# Altium project Flight Controller SoM.PrjPcb (part 2 of 2)

## Sheet MCU_IO.SchDoc: MCU - Peripheral and Pin Assignment
size A2; ApprovedBy: Weymen Koo; CheckedBy: -; DrawnBy: Weymen Koo; DocumentNumber: UBCAD-FCSOM-SCH; Revision: A; SheetNumber: 3; SheetTotal: 18; ProjectTitle: Flight Controller SoM; Status: PRELIMINARY; ReleaseDate: 2026-11-14
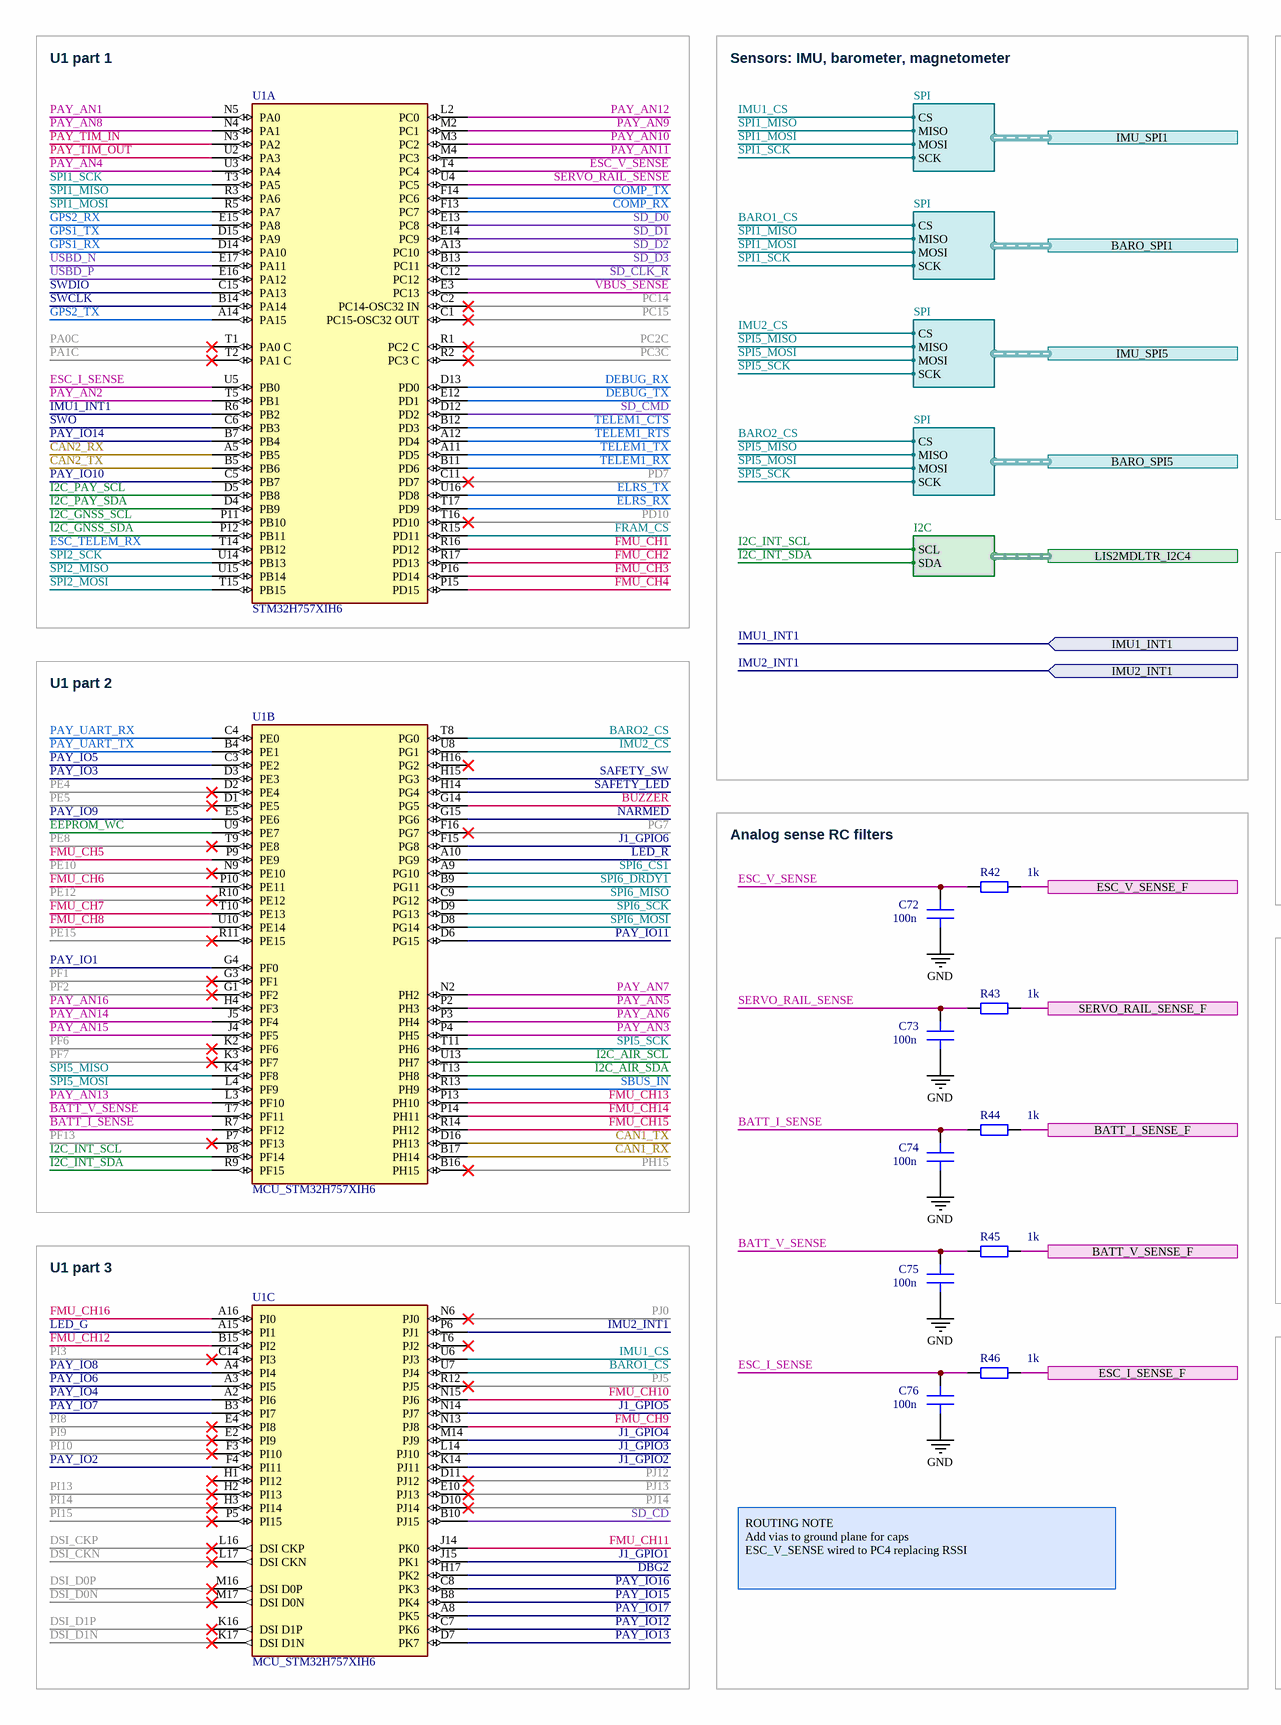
[diagram p12: MCU_IO.SchDoc, left]
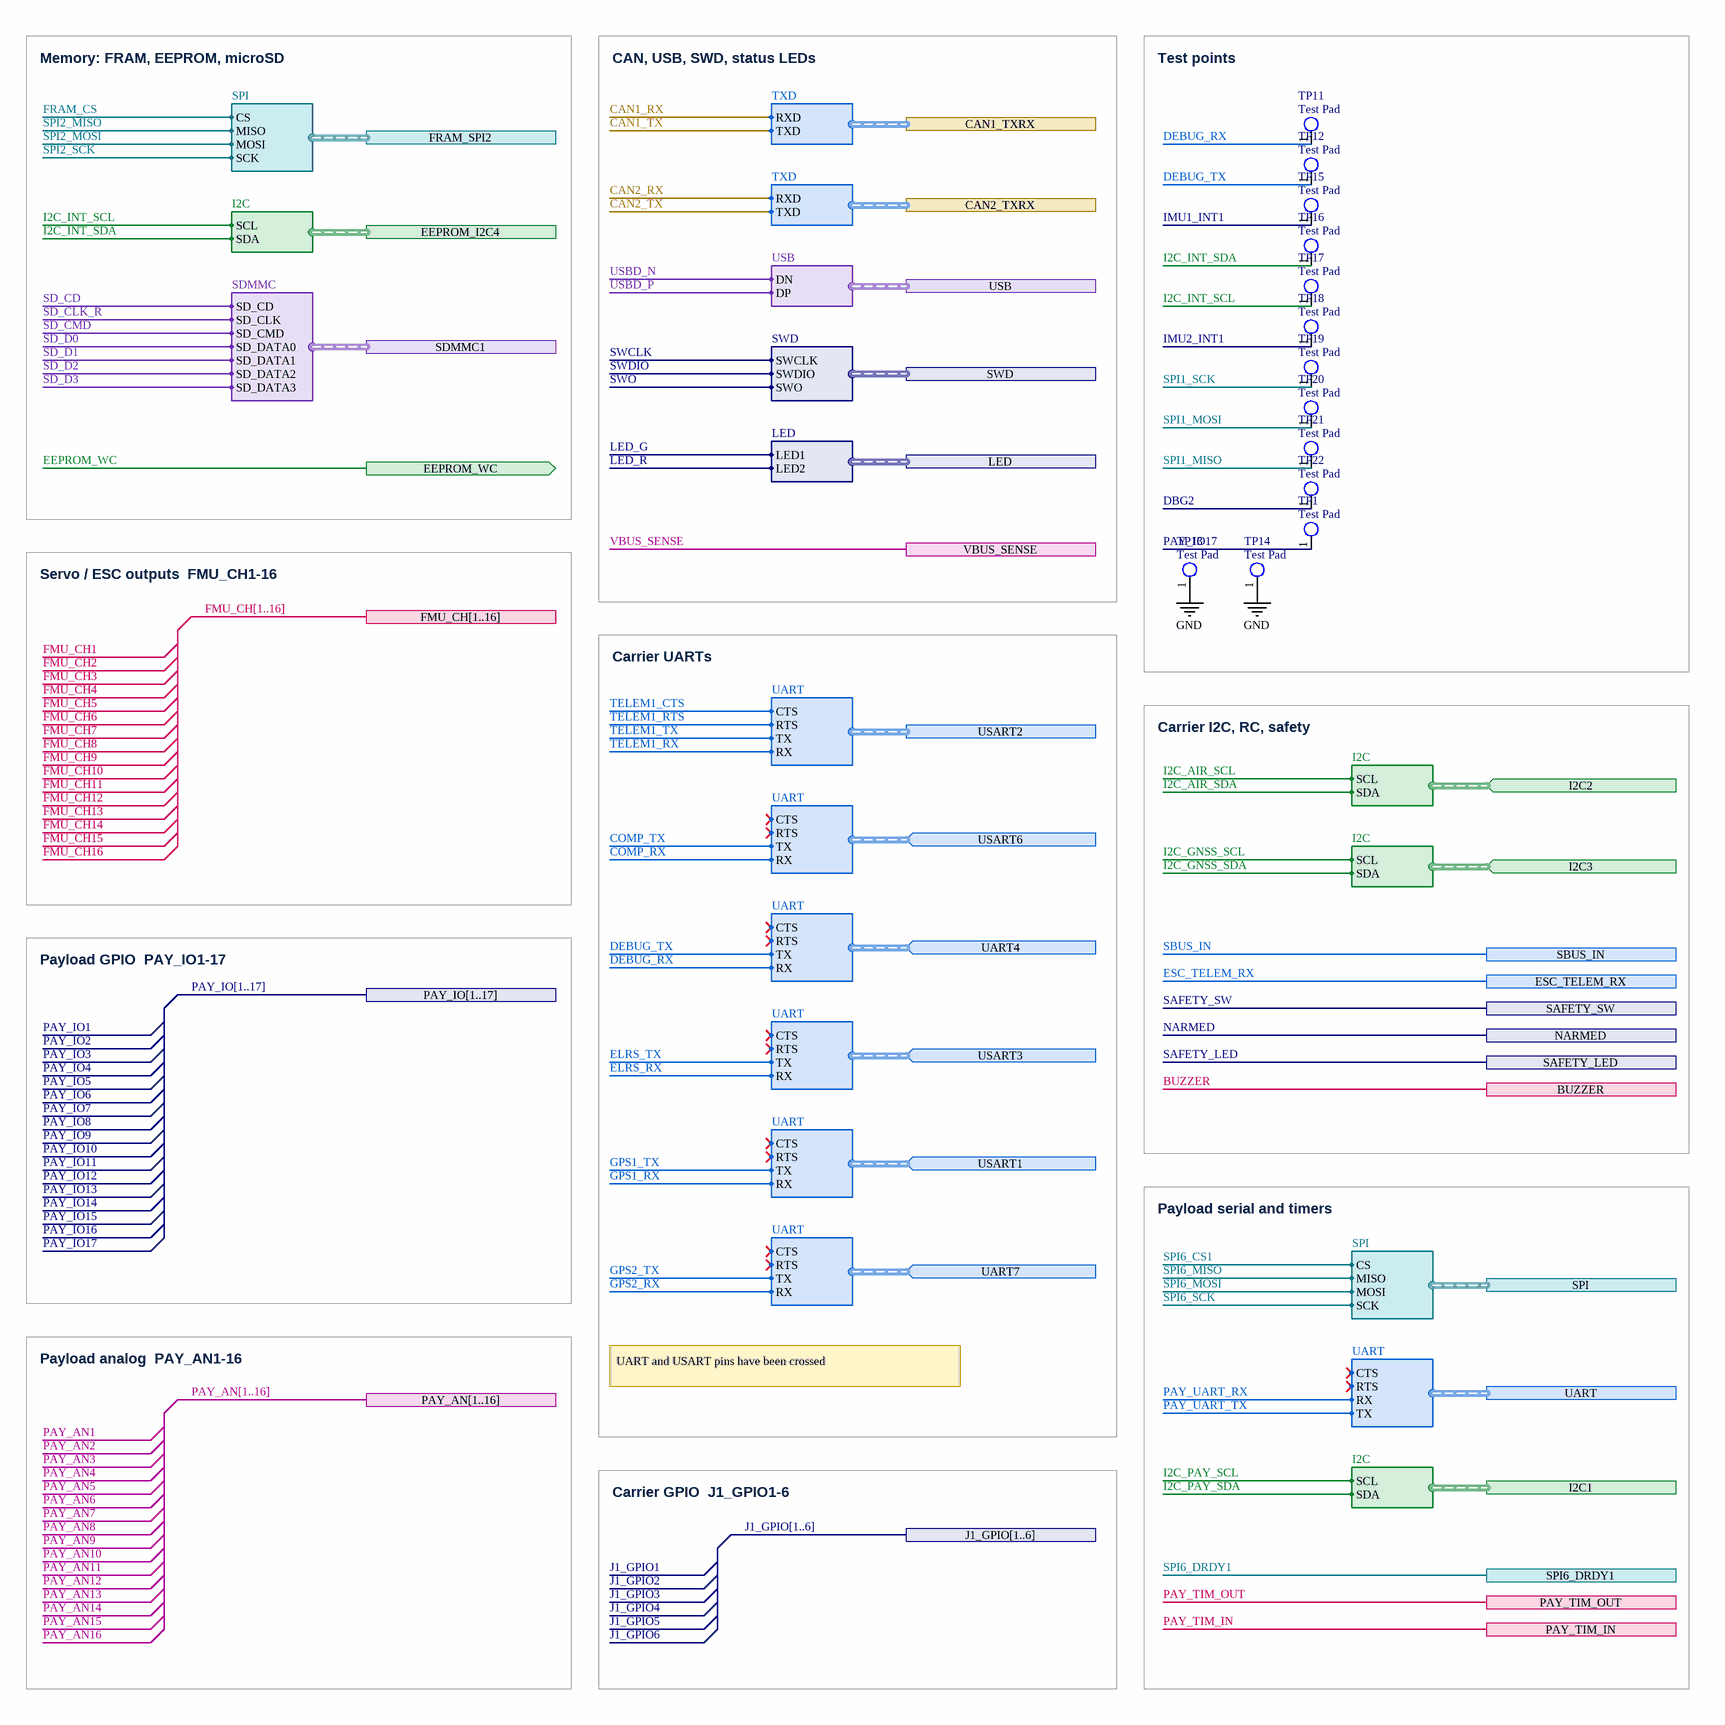
[diagram p13: MCU_IO.SchDoc, right]

### Parts
C72  100n  [IPC C C0402 NO SILK]
C73  100n  [IPC C C0402 NO SILK]
C74  100n  [IPC C C0402 NO SILK]
C75  100n  [IPC C C0402 NO SILK]
C76  100n  [IPC C C0402 NO SILK]
R42  1k  [IPC C R0402 NO SILK]
R43  1k  [IPC C R0402 NO SILK]
R44  1k  [IPC C R0402 NO SILK]
R45  1k  [IPC C R0402 NO SILK]
R46  1k  [IPC C R0402 NO SILK]
TP1  Test Pad  [PCBComponent_1]
TP11  Test Pad  [PCBComponent_1]
TP12  Test Pad  [PCBComponent_1]
TP13  Test Pad  [PCBComponent_1]
TP14  Test Pad  [PCBComponent_1]
TP15  Test Pad  [PCBComponent_1]
TP16  Test Pad  [PCBComponent_1]
TP17  Test Pad  [PCBComponent_1]
TP18  Test Pad  [PCBComponent_1]
TP19  Test Pad  [PCBComponent_1]
TP20  Test Pad  [PCBComponent_1]
TP21  Test Pad  [PCBComponent_1]
TP22  Test Pad  [PCBComponent_1]
U1  STM32H757XIH6  [FP-TFBGA2650-A07U-MFG]  (parts A,B,C of 5)

### Blocks framed on the sheet
U1 part 1: U1
Test points: TP1 TP11-TP22
U1 part 2: U1
Analog sense RC filters: C72-C76 R42-R46
U1 part 3: U1

### Ports
BARO_SPI1 (harness SPI, see 1[5B], 5[6B]), BARO_SPI5 (harness SPI, see 1[5B], 8[6B]), BATT_I_SENSE_F (see 1[4C], 18[2C]), BATT_V_SENSE_F (see 1[4C], 18[2C]), BUZZER (see 1[4D], 18[5A]), CAN1_TXRX (harness TXD, see 1[4C], 13[2B]), CAN2_TXRX (harness TXD, see 1[5A], 14[2B]), EEPROM_I2C4 (harness I2C, see 1[4B], 12[7B]), EEPROM_WC (out, see 1[4B], 12[2B]), ESC_I_SENSE_F (see 1[4C], 18[2C]), ESC_TELEM_RX (see 1[4D], 18[2D]), ESC_V_SENSE_F (see 1[4C], 18[2C]), FMU_CH[1..16] (see 1[4C], 18[5B]), FRAM_SPI2 (harness SPI, see 1[4B], 10[6C]), I2C1 (harness I2C, see 1[5C], 17[5C]), I2C2 (in, harness I2C, see 1[4C], 18[5D]), I2C3 (in, harness I2C, see 1[4C], 18[5C]), IMU1_INT1 (in, see 1[5A], 6[6B]), IMU2_INT1 (in, see 1[5B], 9[7C]), IMU_SPI1 (harness SPI, see 1[5A], 6[7B]), IMU_SPI5 (harness SPI, see 1[5B], 9[7B]), J1_GPIO[1..6] (see 1[4C], 18[5C]), LED (harness LED, see 1[5D], 15[5B]), LIS2MDLTR_I2C4 (harness I2C, see 1[5B], 7[6B]), NARMED (see 1[4D], 18[5A]), PAY_AN[1..16] (see 1[5C], 17[2C]), PAY_IO[1..17] (see 1[5C], 17[5A]), PAY_TIM_IN (see 1[5C], 17[5C]), PAY_TIM_OUT (see 1[5C], 17[5C]), SAFETY_LED (see 1[4D], 18[5A]), SAFETY_SW (see 1[4D], 18[5A]), SBUS_IN (see 1[4D], 18[2D]), SDMMC1 (harness SDMMC, see 1[4B], 11[7B]), SERVO_RAIL_SENSE_F (see 1[4D], 18[2C]), SPI6_DRDY1 (see 1[5C], 17[7C]), SPI (harness SPI, see 1[5C], 17[7B]), SWD (harness SWD, see 1[4A], 16[6C]), UART4 (in, harness UART, see 1[4C], 18[7B]), UART7 (in, harness UART, see 1[4C], 18[7B]), UART (harness UART, see 1[5C], 17[7A]), USART1 (in, harness UART, see 1[4C], 18[7B]), USART2 (harness UART, see 1[4C], 18[7C]), USART3 (in, harness UART, see 1[4C], 18[7A]), USART6 (in, harness UART, see 1[4C], 18[7A]), USB (harness USB, see 1[4A], 16[6B]), VBUS_SENSE (see 1[4B], 16[6A])

### Harnesses
TXD: RXD, TXD
SPI: CS, MISO, MOSI, SCK
SWD: SWCLK, SWDIO, SWO
USB: DN, DP
LED: LED1, LED2
SDMMC: SD_CD, SD_CLK, SD_CMD, SD_DATA0, SD_DATA1, SD_DATA2, SD_DATA3
I2C: SCL, SDA
UART: CTS, RTS, RX, TX
UART: CTS, RTS, TX, RX

### Nets
GND: C72.2 C73.2 C74.2 C75.2 C76.2 TP13.1 TP14.1
BARO1_CS: U1.U7(PJ4) ; port BARO_SPI1.CS
BARO2_CS: U1.T8(PG0) ; port BARO_SPI5.CS
BATT_I_SENSE: C74.1 R44.1 U1.R7(PF12)
BATT_I_SENSE_F: R44.2 ; port BATT_I_SENSE_F
BATT_V_SENSE: C75.1 R45.1 U1.T7(PF11)
BATT_V_SENSE_F: R45.2 ; port BATT_V_SENSE_F
BUZZER: U1.G14(PG5) ; port BUZZER
CAN1_RX: U1.B17(PH14) ; port CAN1_TXRX.RXD
CAN1_TX: U1.D16(PH13) ; port CAN1_TXRX.TXD
CAN2_RX: U1.A5(PB5) ; port CAN2_TXRX.RXD
CAN2_TX: U1.B5(PB6) ; port CAN2_TXRX.TXD
COMP_RX: U1.F13(PC7) ; port USART6.RX
COMP_TX: U1.F14(PC6) ; port USART6.TX
DBG2: TP22.1 U1.H17(PK2)
DEBUG_RX: TP11.1 U1.D13(PD0) ; port UART4.RX
DEBUG_TX: TP12.1 U1.E12(PD1) ; port UART4.TX
DSI_CKN: U1.L17(DSI_CKN)
DSI_CKP: U1.L16(DSI_CKP)
DSI_D0N: U1.M17(DSI_D0N)
DSI_D0P: U1.M16(DSI_D0P)
DSI_D1N: U1.K17(DSI_D1N)
DSI_D1P: U1.K16(DSI_D1P)
EEPROM_WC: U1.U9(PE7) ; port EEPROM_WC
ELRS_RX: U1.T17(PD9) ; port USART3.RX
ELRS_TX: U1.U16(PD8) ; port USART3.TX
ESC_I_SENSE: C76.1 R46.1 U1.U5(PB0)
ESC_I_SENSE_F: R46.2 ; port ESC_I_SENSE_F
ESC_TELEM_RX: U1.T14(PB12) ; port ESC_TELEM_RX
ESC_V_SENSE: C72.1 R42.1 U1.T4(PC4)
ESC_V_SENSE_F: R42.2 ; port ESC_V_SENSE_F
FMU_CH1: U1.R16(PD12)
FMU_CH2: U1.R17(PD13)
FMU_CH3: U1.P16(PD14)
FMU_CH4: U1.P15(PD15)
FMU_CH5: U1.P9(PE9)
FMU_CH6: U1.P10(PE11)
FMU_CH7: U1.T10(PE13)
FMU_CH8: U1.U10(PE14)
FMU_CH9: U1.N13(PJ8)
FMU_CH10: U1.N15(PJ6)
FMU_CH11: U1.J14(PK0)
FMU_CH12: U1.B15(PI2)
FMU_CH13: U1.P13(PH10)
FMU_CH14: U1.P14(PH11)
FMU_CH15: U1.R14(PH12)
FMU_CH16: U1.A16(PI0)
FRAM_CS: U1.R15(PD11) ; port FRAM_SPI2.CS
GPS1_RX: U1.D14(PA10) ; port USART1.RX
GPS1_TX: U1.D15(PA9) ; port USART1.TX
GPS2_RX: U1.E15(PA8) ; port UART7.RX
GPS2_TX: U1.A14(PA15) ; port UART7.TX
I2C_AIR_SCL: U1.U13(PH7) ; port I2C2.SCL
I2C_AIR_SDA: U1.T13(PH8) ; port I2C2.SDA
I2C_GNSS_SCL: U1.P11(PB10) ; port I2C3.SCL
I2C_GNSS_SDA: U1.P12(PB11) ; port I2C3.SDA
I2C_INT_SCL: TP17.1 U1.P8(PF14) ; port EEPROM_I2C4.SCL, port LIS2MDLTR_I2C4.SCL
I2C_INT_SDA: TP16.1 U1.R9(PF15) ; port EEPROM_I2C4.SDA, port LIS2MDLTR_I2C4.SDA
I2C_PAY_SCL: U1.D5(PB8) ; port I2C1.SCL
I2C_PAY_SDA: U1.D4(PB9) ; port I2C1.SDA
IMU1_CS: U1.U6(PJ3) ; port IMU_SPI1.CS
IMU1_INT1: TP15.1 U1.R6(PB2) ; port IMU1_INT1
IMU2_CS: U1.U8(PG1) ; port IMU_SPI5.CS
IMU2_INT1: TP18.1 U1.P6(PJ1) ; port IMU2_INT1
J1_GPIO1: U1.J15(PK1)
J1_GPIO2: U1.K14(PJ11)
J1_GPIO3: U1.L14(PJ10)
J1_GPIO4: U1.M14(PJ9)
J1_GPIO5: U1.N14(PJ7)
J1_GPIO6: U1.F15(PG8)
LED_G: U1.A15(PI1) ; port LED.LED1
LED_R: U1.A10(PG9) ; port LED.LED2
NARMED: U1.G15(PG6) ; port NARMED
PA0C: U1.T1(PA0_C)
PA1C: U1.T2(PA1_C)
PAY_AN1: U1.N5(PA0)
PAY_AN2: U1.T5(PB1)
PAY_AN3: U1.P4(PH5)
PAY_AN4: U1.U3(PA4)
PAY_AN5: U1.P2(PH3)
PAY_AN6: U1.P3(PH4)
PAY_AN7: U1.N2(PH2)
PAY_AN8: U1.N4(PA1)
PAY_AN9: U1.M2(PC1)
PAY_AN10: U1.M3(PC2)
PAY_AN11: U1.M4(PC3)
PAY_AN12: U1.L2(PC0)
PAY_AN13: U1.L3(PF10)
PAY_AN14: U1.J5(PF4)
PAY_AN15: U1.J4(PF5)
PAY_AN16: U1.H4(PF3)
PAY_IO1: U1.G4(PF0)
PAY_IO2: U1.F4(PI11)
PAY_IO3: U1.D3(PE3)
PAY_IO4: U1.A2(PI6)
PAY_IO5: U1.C3(PE2)
PAY_IO6: U1.A3(PI5)
PAY_IO7: U1.B3(PI7)
PAY_IO8: U1.A4(PI4)
PAY_IO9: U1.E5(PE6)
PAY_IO10: U1.C5(PB7)
PAY_IO11: U1.D6(PG15)
PAY_IO12: U1.C7(PK6)
PAY_IO13: U1.D7(PK7)
PAY_IO14: U1.B7(PB4)
PAY_IO15: U1.B8(PK4)
PAY_IO16: U1.C8(PK3)
PAY_IO17: TP1.1 U1.A8(PK5)
PAY_TIM_IN: U1.N3(PA2) ; port PAY_TIM_IN
PAY_TIM_OUT: U1.U2(PA3) ; port PAY_TIM_OUT
PAY_UART_RX: U1.C4(PE0) ; port UART.RX
PAY_UART_TX: U1.B4(PE1) ; port UART.TX
PC2C: U1.R1(PC2_C)
PC3C: U1.R2(PC3_C)
PC14: U1.C2(PC14-OSC32_IN)
PC15: U1.C1(PC15-OSC32_OUT)
PD7: U1.C11(PD7)
PD10: U1.T16(PD10)
PE4: U1.D2(PE4)
PE5: U1.D1(PE5)
PE8: U1.T9(PE8)
PE10: U1.N9(PE10)
PE12: U1.R10(PE12)
PE15: U1.R11(PE15)
PF1: U1.G3(PF1)
PF2: U1.G1(PF2)
PF6: U1.K2(PF6)
PF7: U1.K3(PF7)
PF13: U1.P7(PF13)
PG7: U1.F16(PG7)
PH15: U1.B16(PH15)
PI3: U1.C14(PI3)
PI8: U1.E4(PI8)
PI9: U1.E2(PI9)
PI10: U1.F3(PI10)
PI13: U1.H2(PI13)
PI14: U1.H3(PI14)
PI15: U1.P5(PI15)
PJ0: U1.N6(PJ0)
PJ5: U1.R12(PJ5)
PJ12: U1.D11(PJ12)
PJ13: U1.E10(PJ13)
PJ14: U1.D10(PJ14)
SAFETY_LED: U1.H14(PG4) ; port SAFETY_LED
SAFETY_SW: U1.H15(PG3) ; port SAFETY_SW
SBUS_IN: U1.R13(PH9) ; port SBUS_IN
SD_CD: U1.B10(PJ15) ; port SDMMC1.SD_CD
SD_CLK_R: U1.C12(PC12) ; port SDMMC1.SD_CLK
SD_CMD: U1.D12(PD2) ; port SDMMC1.SD_CMD
SD_D0: U1.E13(PC8) ; port SDMMC1.SD_DATA0
SD_D1: U1.E14(PC9) ; port SDMMC1.SD_DATA1
SD_D2: U1.A13(PC10) ; port SDMMC1.SD_DATA2
SD_D3: U1.B13(PC11) ; port SDMMC1.SD_DATA3
SERVO_RAIL_SENSE: C73.1 R43.1 U1.U4(PC5)
SERVO_RAIL_SENSE_F: R43.2 ; port SERVO_RAIL_SENSE_F
SPI1_MISO: TP21.1 U1.R3(PA6) ; port IMU_SPI1.MISO, port BARO_SPI1.MISO
SPI1_MOSI: TP20.1 U1.R5(PA7) ; port IMU_SPI1.MOSI, port BARO_SPI1.MOSI
SPI1_SCK: TP19.1 U1.T3(PA5) ; port IMU_SPI1.SCK, port BARO_SPI1.SCK
SPI2_MISO: U1.U15(PB14) ; port FRAM_SPI2.MISO
SPI2_MOSI: U1.T15(PB15) ; port FRAM_SPI2.MOSI
SPI2_SCK: U1.U14(PB13) ; port FRAM_SPI2.SCK
SPI5_MISO: U1.K4(PF8) ; port IMU_SPI5.MISO, port BARO_SPI5.MISO
SPI5_MOSI: U1.L4(PF9) ; port IMU_SPI5.MOSI, port BARO_SPI5.MOSI
SPI5_SCK: U1.T11(PH6) ; port IMU_SPI5.SCK, port BARO_SPI5.SCK
SPI6_CS1: U1.A9(PG10) ; port SPI.CS
SPI6_DRDY1: U1.B9(PG11) ; port SPI6_DRDY1
SPI6_MISO: U1.C9(PG12) ; port SPI.MISO
SPI6_MOSI: U1.D8(PG14) ; port SPI.MOSI
SPI6_SCK: U1.D9(PG13) ; port SPI.SCK
SWCLK: U1.B14(PA14) ; port SWD.SWCLK
SWDIO: U1.C15(PA13) ; port SWD.SWDIO
SWO: U1.C6(PB3) ; port SWD.SWO
TELEM1_CTS: U1.B12(PD3) ; port USART2.CTS
TELEM1_RTS: U1.A12(PD4) ; port USART2.RTS
TELEM1_RX: U1.B11(PD6) ; port USART2.RX
TELEM1_TX: U1.A11(PD5) ; port USART2.TX
USBD_N: U1.E17(PA11) ; port USB.DN
USBD_P: U1.E16(PA12) ; port USB.DP
VBUS_SENSE: U1.E3(PC13) ; port VBUS_SENSE

Not connected (* = marked no-connect by the designer): U1 H1(PI12)* H16(PG2)* T6(PJ2)*

### Buses and harness runs
bus FMU_CH[1..16] = port FMU_CH[1..16]
bus J1_GPIO[1..6] = port J1_GPIO[1..6]
bus PAY_AN[1..16] = port PAY_AN[1..16]
bus PAY_IO[1..17] = port PAY_IO[1..17]

### Notes on the sheet
- Sensors: IMU, barometer, magnetometer
- Memory: FRAM, EEPROM, microSD
- CAN, USB, SWD, status LEDs
- Servo / ESC outputs  FMU_CH1-16
- Carrier UARTs
- Carrier I2C, RC, safety
- Payload GPIO  PAY_IO1-17
- Payload serial and timers
- Payload analog  PAY_AN1-16
- UART and USART pins have been crossed
- Carrier GPIO  J1_GPIO1-6
- ROUTING NOTE
  Add vias to ground plane for caps
  ESC_V_SENSE wired to PC4 replacing RSSI
- PROJECT
- KEY
- POWER
- 5 V class
- 3.3 V class
- Core / SMPS
- GND
- SHEET TITLE
- SIGNALS
- NOTES
- SPI
- Analog
- Design
- I2C
- PWM/Timer
- Layout
- UART/RC
- GPIO/Ctrl
- Assembly
- CAN
- Unused pin
- Firmware
- USB/SD/Clk
- Critical
- DRAWN
- DOCUMENT NO.
- CHECKED
- REV
- STATUS
- APPROVED
- DATE
- FILE
- SIZE
- A2
- SHEET
- of

### Library data of the parts
C72-C76 = CMP-002-000000-4: CAP 100n 16V X7R 10% 0402; Manufacturer: Samsung; Manufacturer Part Number: CL05B104KO5NNNC; Value: 100n; Source: Schlib1.SchLib; Design Item ID: Generic CAP 0402; Package: 0402; Tolerance: 10%; Voltage: 16V; Dielectric: X7R; LCSC Part #: C1525
R42-R46 = CMP-008-000000-2: RES 1k 1% 1/16W 0402; Manufacturer: UNI-ROYAL; Manufacturer Part Number: 0402WGF1001TCE; Value: 1k; Source: Schlib1.SchLib; Design Item ID: Generic RES 0402; Package: 0402; Tolerance: 1%; Power: 1/16W; LCSC Part #: C11702
TP1 TP11-TP22 = CMP-092-000000-4: Design Item ID: TP; Source: Testpoint.SchLib
U1 = CMP-029-000010-1: MCU 32-bit ARM Cortex M7/M4 RISC 2MB Flash 3.3V 265-Pin TFBGA Tray; Component Type: Standard; Design Item ID: MCU_STM32H757XIH6; Pin Count: 265; Source: CRLS Lib.SchLib

## Sheet Power.SchDoc: Power - eFuse, Power Mux, Buck, Sensor LDO
size A3; ApprovedBy: Weymen Koo; CheckedBy: -; DrawnBy: Weymen Koo; DocumentNumber: UBCAD-FCSOM-SCH; Revision: A; SheetNumber: 2; SheetTotal: 18; ProjectTitle: Flight Controller SoM; Status: PRELIMINARY; ReleaseDate: 2026-11-14
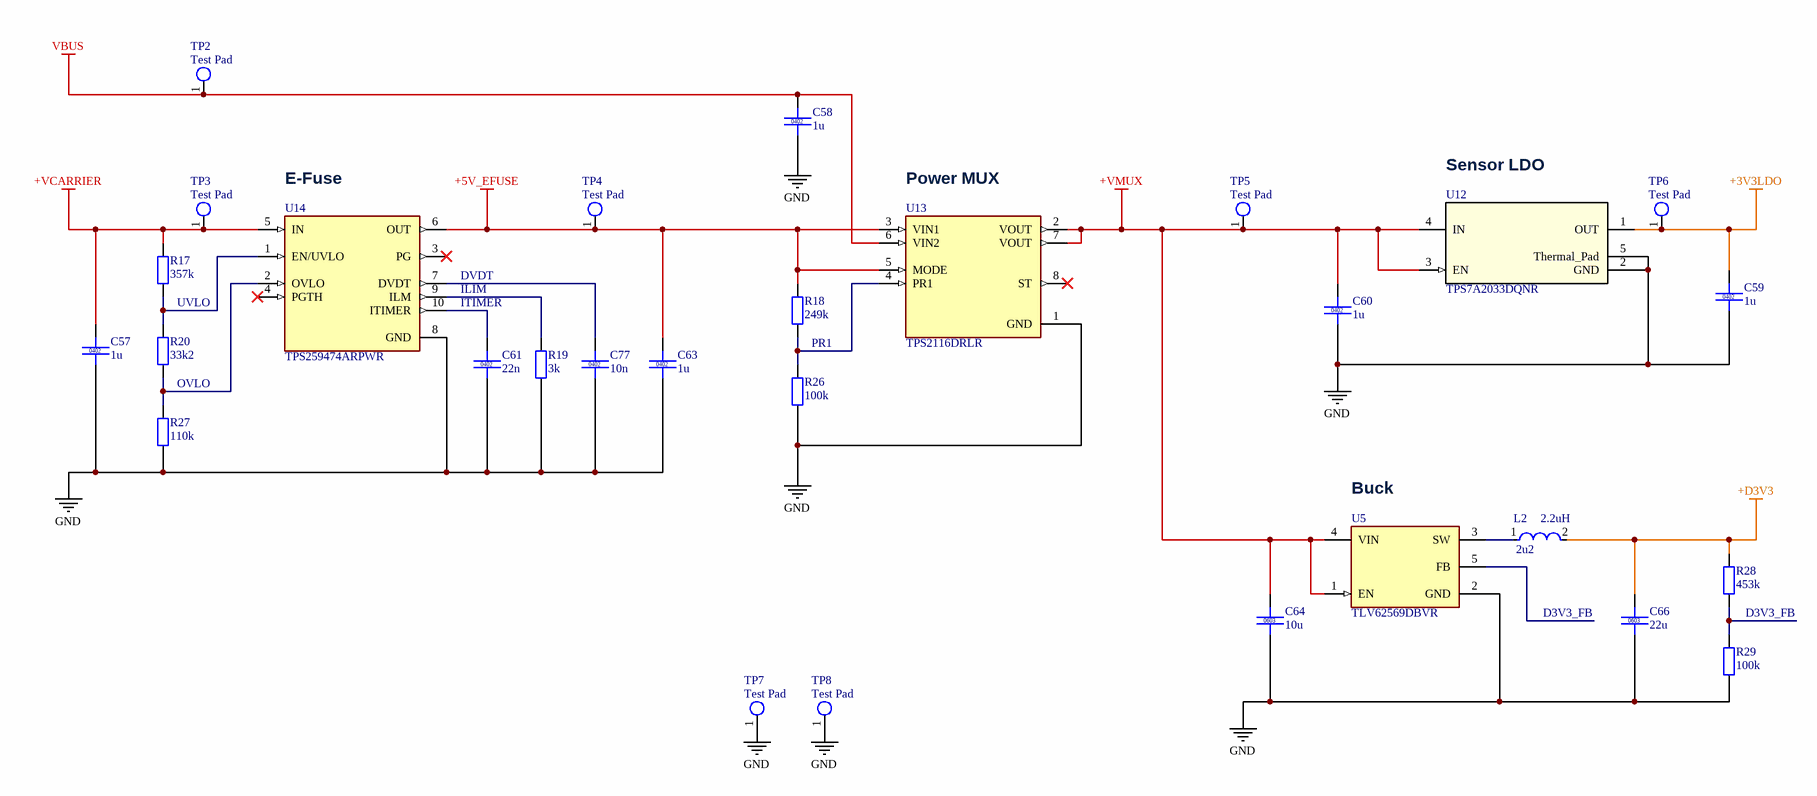
[diagram p14: Power.SchDoc]

### Parts
C57  1u  [CAPC1005X05N]
C58  1u  [CAPC1005X05N]
C59  1u  [CAPC1005X05N]
C60  1u  [CAPC1005X05N]
C61  22n  [CAPC1005X05N]
C63  1u  [CAPC1005X05N]
C64  10u  [CAPC1608X08N]
C66  22u  [CAPC1608X08N]
C77  10n  [CAPC1005X05N]
L2  2u2  Inductance: 2.2uH  [FP-DFE252012C-IPC_B]
R17  357k  [IPC C R0402 NO SILK]
R18  249k  [IPC C R0402 NO SILK]
R19  3k  [IPC C R0402 NO SILK]
R20  33k2  [IPC C R0402 NO SILK]
R26  100k  [IPC C R0402 NO SILK]
R27  110k  [IPC C R0402 NO SILK]
R28  453k  [IPC C R0402 NO SILK]
R29  100k  [IPC C R0402 NO SILK]
TP2  Test Pad  [PCBComponent_1]
TP3  Test Pad  [PCBComponent_1]
TP4  Test Pad  [PCBComponent_1]
TP5  Test Pad  [PCBComponent_1]
TP6  Test Pad  [PCBComponent_1]
TP7  Test Pad  [PCBComponent_1]
TP8  Test Pad  [PCBComponent_1]
U5  TLV62569DBVR  [FP-DBV0005A-MFG]
U12  TPS7A2033DQNR  [DQN0004A-MFG]
U13  TPS2116DRLR  [SOTFL50P160X60-8N]
U14  TPS259474ARPWR  [IC_TPS259474ARPWR]

### Nets
+3V3LDO: C59.1 TP6.1 U12.1(OUT)
+5V_EFUSE: C63.1 R18.2 TP4.1 U13.3(VIN1) U13.5(MODE) U14.6(OUT)
+D3V3: C66.1 L2.2 R28.2
+VCARRIER: C57.1 R17.2 TP3.1 U14.5(IN)
+VMUX: C60.1 C64.1 TP5.1 U5.1(EN) U5.4(VIN) U12.3(EN) U12.4(IN) U13.2(VOUT) U13.7(VOUT)
GND: C57.2 C58.2 C59.2 C60.2 C61.2 C63.2 C64.2 C66.2 C77.2 R19.2 R26.1 R27.1 R29.1 TP7.1 TP8.1 U5.2(GND) U12.2(GND) U12.5(Thermal_Pad) U13.1(GND) U14.8(GND)
VBUS: C58.1 TP2.1 U13.6(VIN2)
D3V3_FB: R28.1 R29.2 U5.5(FB)
DVDT: C77.1 U14.7(DVDT)
ILIM: R19.1 U14.9(ILM)
ITIMER: C61.1 U14.10(ITIMER)
OVLO: R20.1 R27.2 U14.2(OVLO)
PR1: R18.1 R26.2 U13.4(PR1)
UVLO: R17.1 R20.2 U14.1(EN/UVLO)
NetL2_1: L2.1 U5.3(SW)

Not connected (* = marked no-connect by the designer): U13 8(ST)*; U14 3(PG)* 4(PGTH)*

### Notes on the sheet
- (near U14) E-Fuse
- (near U13) Power MUX
- Sensor LDO
- (near U5) Buck
- PROJECT
- KEY
- POWER
- 5 V class
- 3.3 V class
- Core / SMPS
- GND
- SHEET TITLE
- SIGNALS
- NOTES
- SPI
- Analog
- Design
- I2C
- PWM/Timer
- Layout
- UART/RC
- GPIO/Ctrl
- Assembly
- CAN
- Unused pin
- Firmware
- USB/SD/Clk
- Critical
- DRAWN
- DOCUMENT NO.
- CHECKED
- REV
- STATUS
- APPROVED
- DATE
- FILE
- SIZE
- A3
- SHEET
- of

### Library data of the parts
C57-C60 C63 = CMP-002-000094-5: CAP 1u 25V X5R 10% 0402; Manufacturer: Samsung; Manufacturer Part Number: CL05A105KA5NQNC; Value: 1u; Tolerance: 10%; Package: 0402; Voltage: 25V; Dielectric: X5R; LCSC Part #: C52923
C61 = CMP-002-000094-5: CAP 22n 50V X7R 10% 0402; Manufacturer: FH; Manufacturer Part Number: 0402B223K500NT; Value: 22n; Tolerance: 10%; Package: 0402; Voltage: 50V; Dielectric: X7R; LCSC Part #: C1532
C64 = CMP-002-000095-4: CAP 10u 25V X5R 20% 0603; Manufacturer: Samsung; Manufacturer Part Number: CL10A106MA8NRNC; Value: 10u; Tolerance: 20%; Package: 0603; Voltage: 25V; Dielectric: X5R; LCSC Part #: C96446
C66 = CMP-002-000095-4: CAP 22u 6.3V X5R 20% 0603; Manufacturer: Samsung; Manufacturer Part Number: CL10A226MQ8NRNC; Value: 22u; Tolerance: 20%; Package: 0603; Voltage: 6.3V; Dielectric: X5R; LCSC Part #: C59461
C77 = CMP-002-000094-5: CAP 10n 50V X7R 10% 0402; Manufacturer: Samsung; Manufacturer Part Number: CL05B103KB5NNNC; Value: 10n; Tolerance: 10%; Package: 0402; Voltage: 50V; Dielectric: X7R; LCSC Part #: C15195
L2 = CMP-06042-014676-1: Shielded Wirewound Inductor 2.2uH 20% 2300mA 0.082Ω 1008 (2520); Manufacturer: Murata; Manufacturer Part Number: DFE252012F-2R2M=P2; DC Resistance (DCR): 82mR; Test Frequency: 1MHz; Saturation Current: 3.6A; Core Material: Ferrite; Current Rating: 2.3A; Case/Package: 1008; Tolerance: 20%; Max Operating Temperature: 125°C; Shielding: Shielded; Height - Seated (Max): 0.047inch; Packaging: Tape and Reel; Min Operating Temperature: -40°C; Length: 0.098inch; Width: 0.079inch; Case Code (Imperial): 1008; Mount: Surface Mount; Case Code (Metric): 2520; Value: 2u2; Package: 2520
R17 = CMP-008-000000-2: RES 357k 1% 1/16W 0402; Manufacturer: UNI-ROYAL; Manufacturer Part Number: 0402WGF3573TCE; Value: 357k; Source: Schlib1.SchLib; Design Item ID: Generic RES 0402; Package: 0402; Tolerance: 1%; Power: 1/16W; LCSC Part #: C27005
R18 = CMP-008-000000-2: RES 249k 1% 1/16W 0402; Manufacturer: UNI-ROYAL; Manufacturer Part Number: 0402WGF2493TCE; Value: 249k; Source: Schlib1.SchLib; Design Item ID: Generic RES 0402; Package: 0402; Tolerance: 1%; Power: 1/16W
R19 = CMP-008-000000-2: RES 3k 1% 1/16W 0402; Manufacturer: UNI-ROYAL; Manufacturer Part Number: 0402WGF3001TCE; Value: 3k; Source: Schlib1.SchLib; Design Item ID: Generic RES 0402; Package: 0402; Tolerance: 1%; Power: 1/16W; LCSC Part #: C25784
R20 = CMP-008-000000-2: RES 33k2 1% 1/16W 0402; Manufacturer: UNI-ROYAL; Manufacturer Part Number: 0402WGF3322TCE; Value: 33k2; Source: Schlib1.SchLib; Design Item ID: Generic RES 0402; Package: 0402; Tolerance: 1%; Power: 1/16W; LCSC Part #: C122548
R26 R29 = CMP-008-000000-2: RES 100k 1% 1/16W 0402; Manufacturer: UNI-ROYAL; Manufacturer Part Number: 0402WGF1003TCE; Value: 100k; Source: Schlib1.SchLib; Design Item ID: Generic RES 0402; Package: 0402; Tolerance: 1%; Power: 1/16W; LCSC Part #: C25741
R27 = CMP-008-000000-2: RES 110k 1% 1/16W 0402; Manufacturer: UNI-ROYAL; Manufacturer Part Number: 0402WGF1103TCE; Value: 110k; Source: Schlib1.SchLib; Design Item ID: Generic RES 0402; Package: 0402; Tolerance: 1%; Power: 1/16W
R28 = CMP-008-000000-2: RES 453k 1% 1/16W 0402; Manufacturer: Walsin; Manufacturer Part Number: WR04X4533FTL; Value: 453k; Source: Schlib1.SchLib; Design Item ID: Generic RES 0402; Package: 0402; Tolerance: 1%; Power: 1/16W; LCSC Part #: C170322
TP2-TP8 = CMP-092-000000-4: Design Item ID: TP; Source: Testpoint.SchLib
U5 = CMP-04918-000387-1: IC REG BUCK ADJ 2A SOT23-5; Output Configuration: Positive; Min Output Voltage: 600mV; Max Output Voltage: 5.5V; Switching Frequency: 1.5MHz; Output Type: Adjustable; Synchronous Rectifier: Yes; Min Input Voltage: 2.5V; Output Current: 2A; Mount: Surface Mount; Min Operating Temperature: -40°C; Max Operating Temperature: 125°C; RoHS Compliant: Yes; Max Input Voltage: 5.5V; Case/Package: SOT-23-5; Packaging: Cut Tape
U12 = CMP-341-000000-2: 300mA ultra-low-noise low-IQ low-dropout (LDO) linear regulator with high PSRR 4-X2SON -40 to 125; Manufacturer_Name: Texas Instruments; Design Item ID: TPS7A2033DQNR; Source: TPS7A2033DQNR.SchLib; RefDes: RefDes; TYPE: TYPE; Copyright: Copyright (C) 2025 Ultra Librarian. All rights reserved.; Manufacturer_Part_Number: TPS7A2033DQNR
U13 = CMP-110-000001-1: Power mux, 1.6 V to 5.5 V, 2.5 A, priority select; MF: Texas Instruments; Package: None; Value: *; Design Item ID: TPS2116DRLR; Check_prices: https://www.snapeda.com/parts/TPS2116DRLR/Texas+Instruments/view-part/?ref=eda; Source: TPS2116DRLR.SchLib; SnapEDA_Link: https://www.snapeda.com/parts/TPS2116DRLR/Texas+Instruments/view-part/?ref=snap; Pin Count: 8; MP: TPS2116DRLR; Component Type: Standard
U14 = CMP-334-000000-1: eFuse, 2.7 V to 23 V, 5.5 A, reverse current blocking; MF: Texas Instruments; Pin Count: 10; MP: TPS259474ARPWR; Source: TPS259474ARPWR.SchLib; Value: *; Component Type: Standard; Design Item ID: TPS259474ARPWR; Check_prices: https://www.snapeda.com/parts/TPS259474ARPWR/Texas+Instruments/view-part/?ref=eda; Package: VFQFN-10 Texas Instruments; SnapEDA_Link: https://www.snapeda.com/parts/TPS259474ARPWR/Texas+Instruments/view-part/?ref=snap

## Sheet Interface_Conn1_Carrier_Board.SchDoc: Connector - Carrier J4 DF17 80-pin (Flight I/O)
size A3; ApprovedBy: Weymen Koo; CheckedBy: -; DrawnBy: Weymen Koo; DocumentNumber: UBCAD-FCSOM-SCH; Revision: A; SheetNumber: 17; SheetTotal: 18; ProjectTitle: Flight Controller SoM; Status: PRELIMINARY; ReleaseDate: 2026-11-14
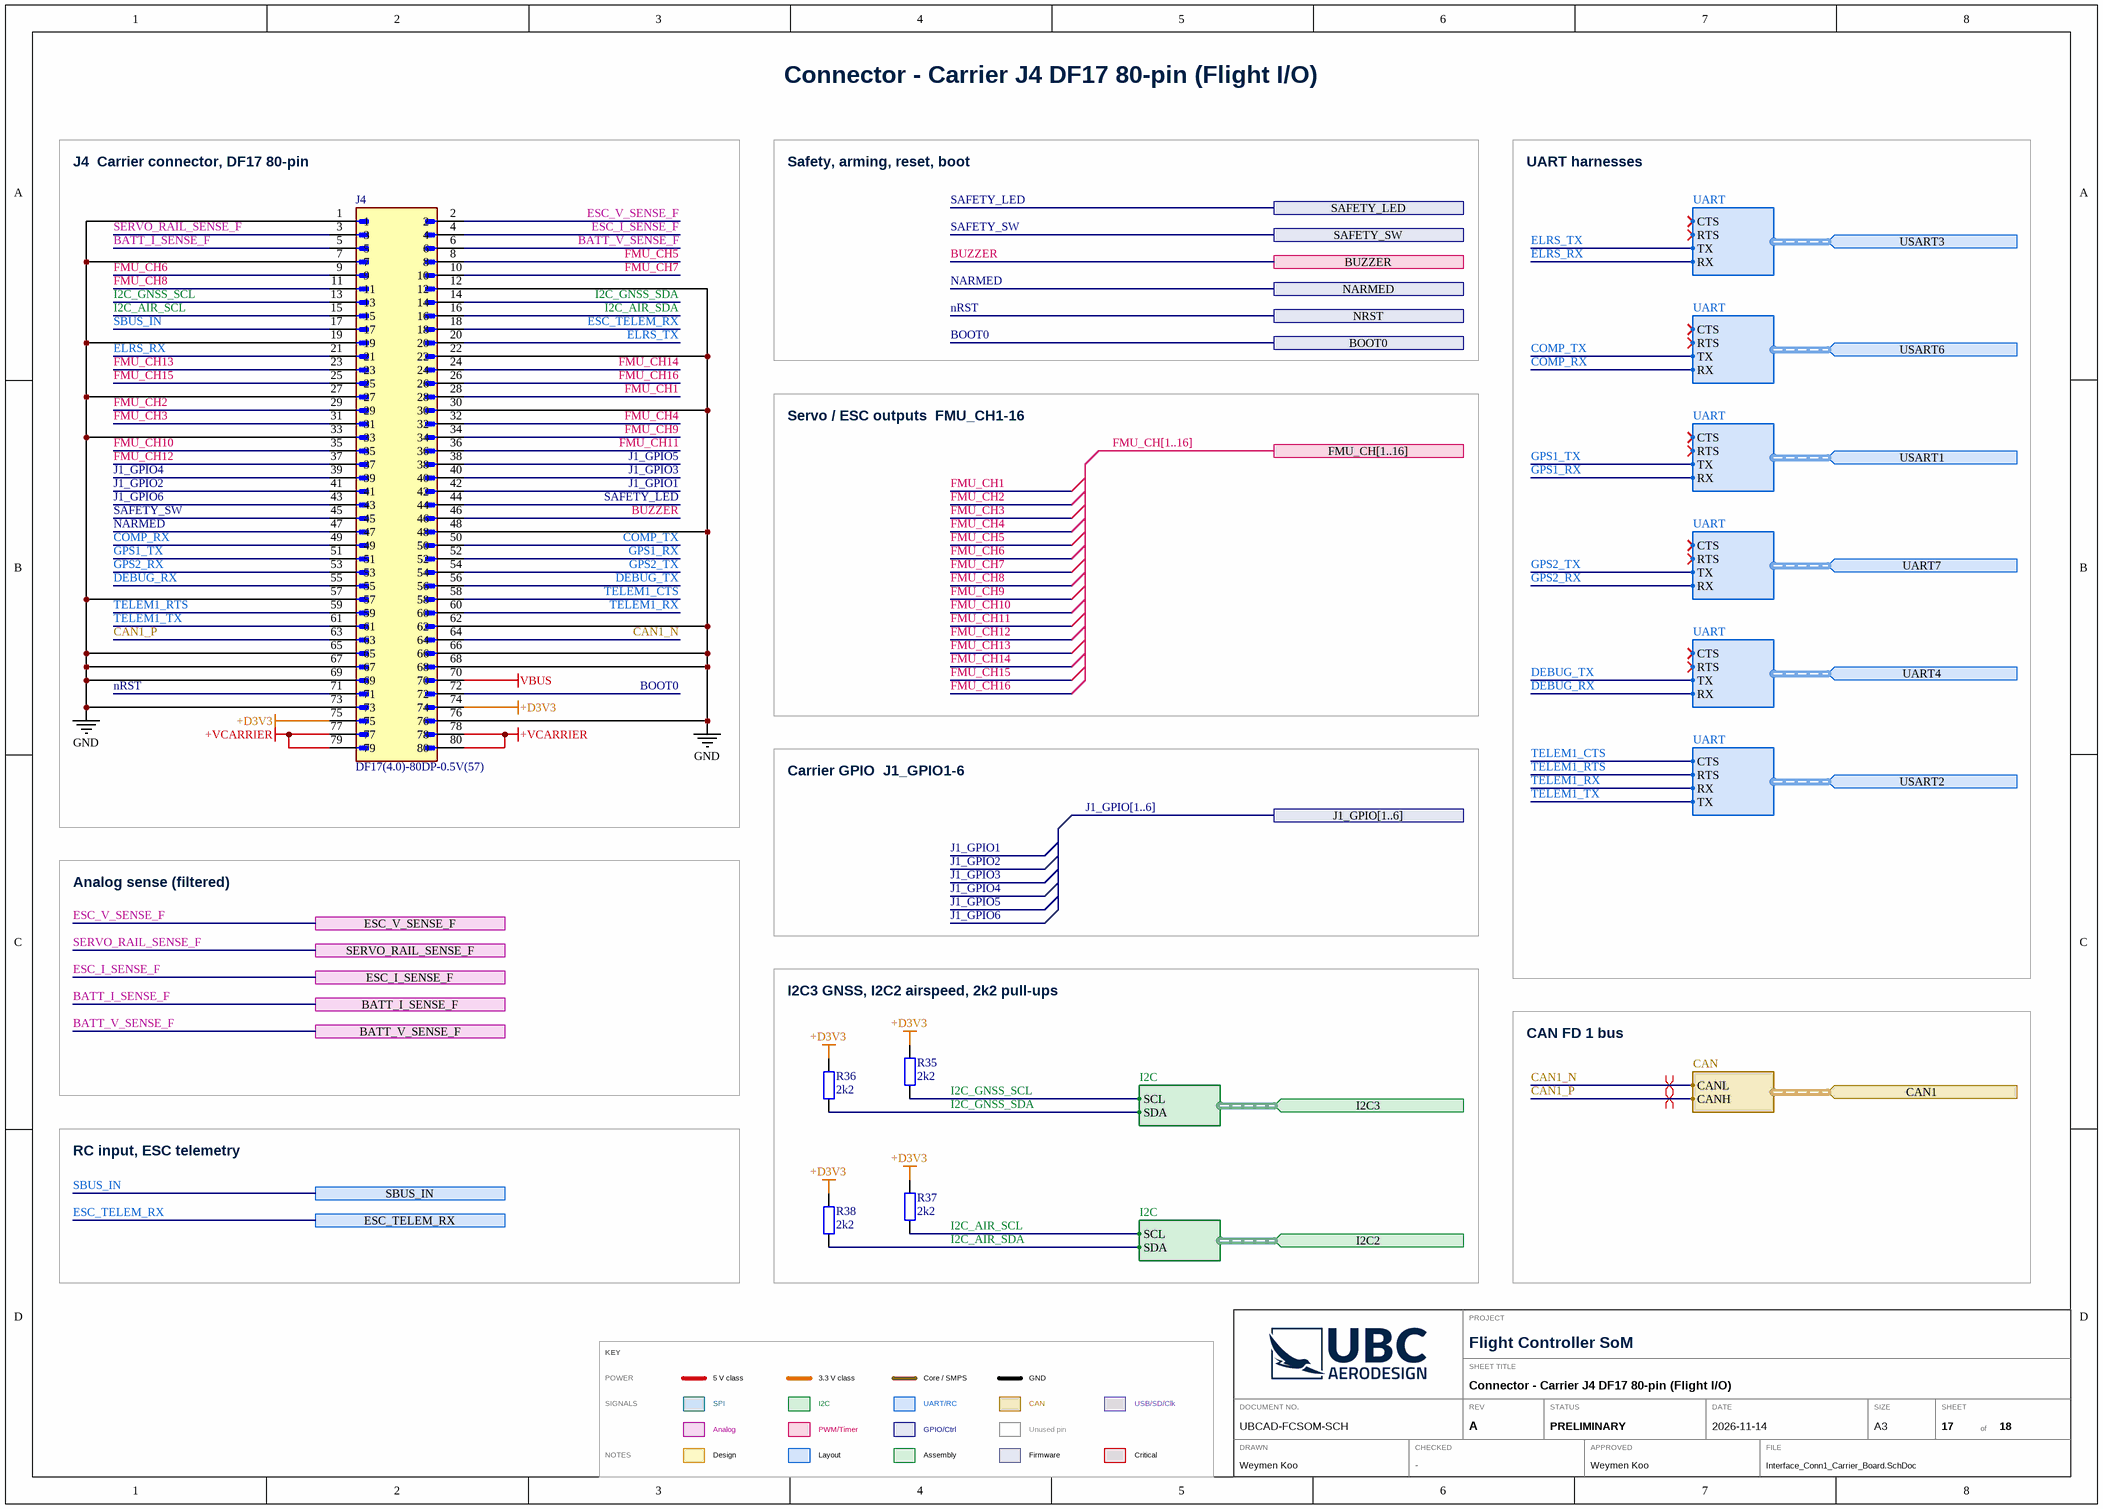
[diagram p15: Interface_Conn1_Carrier_Board.SchDoc]

### Parts
J4  DF17(4.0)-80DP-0.5V(57)  [HRS_DF17(4.0)-80DP-0.5V(57)]
R35  2k2  [IPC C R0402 NO SILK]
R36  2k2  [IPC C R0402 NO SILK]
R37  2k2  [IPC C R0402 NO SILK]
R38  2k2  [IPC C R0402 NO SILK]

### Blocks framed on the sheet
J4  Carrier connector, DF17 80-pin: J4
I2C3 GNSS, I2C2 airspeed, 2k2 pull-ups: R35-R38

### Ports
BATT_I_SENSE_F (see 1[2C], 4[8@]), BATT_V_SENSE_F (see 1[2C], 4[8@]), BOOT0 (see 1[2A], 3[7D]), BUZZER (see 1[2D], 4[9@]), CAN1 (in, harness CAN, see 1[2C], 13[7B]), ESC_I_SENSE_F (see 1[2C], 4[8A]), ESC_TELEM_RX (see 1[2D], 4[9@]), ESC_V_SENSE_F (see 1[2C], 4[8@]), FMU_CH[1..16] (see 1[2C], 4[8A]), I2C2 (in, harness I2C, see 1[2C], 4[4@]), I2C3 (in, harness I2C, see 1[2C], 4[0@]), J1_GPIO[1..6] (see 1[2C], 4[3C]), NARMED (see 1[2D], 4[9@]), NRST (see 1[2A], 3[7C], 15[6C]), SAFETY_LED (see 1[2D], 4[9@]), SAFETY_SW (see 1[2D], 4[9@]), SBUS_IN (see 1[2D], 4[9@]), SERVO_RAIL_SENSE_F (see 1[2D], 4[8@]), UART4 (in, harness UART, see 1[2C], 4[9A]), UART7 (in, harness UART, see 1[2C], 4[9@]), USART1 (in, harness UART, see 1[2C], 4[9A]), USART2 (in, harness UART, see 1[2C], 4[9B]), USART3 (in, harness UART, see 1[2C], 4[9A]), USART6 (in, harness UART, see 1[2C], 4[9B])

### Harnesses
CAN: CANL, CANH
I2C: SCL, SDA
UART: CTS, RTS, RX, TX
UART: CTS, RTS, TX, RX

### Nets
+D3V3: J4.74 J4.75 R35.2 R36.2 R37.2 R38.2
+VCARRIER: J4.77 J4.78 J4.79 J4.80
GND: J4.1 J4.7 J4.12 J4.19 J4.22 J4.27 J4.30 J4.33 J4.48 J4.57 J4.62 J4.65 J4.66 J4.67 J4.68 J4.69 J4.73 J4.76
VBUS: J4.70
BATT_I_SENSE_F: J4.5 ; port BATT_I_SENSE_F
BATT_V_SENSE_F: J4.6 ; port BATT_V_SENSE_F
BOOT0: J4.72 ; port BOOT0
BUZZER: J4.46 ; port BUZZER
CAN1_N: J4.64 ; port CAN1.CANL
CAN1_P: J4.63 ; port CAN1.CANH
COMP_RX: J4.49 ; port USART6.RX
COMP_TX: J4.50 ; port USART6.TX
DEBUG_RX: J4.55 ; port UART4.RX
DEBUG_TX: J4.56 ; port UART4.TX
ELRS_RX: J4.21 ; port USART3.RX
ELRS_TX: J4.20 ; port USART3.TX
ESC_I_SENSE_F: J4.4 ; port ESC_I_SENSE_F
ESC_TELEM_RX: J4.18 ; port ESC_TELEM_RX
ESC_V_SENSE_F: J4.2 ; port ESC_V_SENSE_F
FMU_CH1: J4.28
FMU_CH2: J4.29
FMU_CH3: J4.31
FMU_CH4: J4.32
FMU_CH5: J4.8
FMU_CH6: J4.9
FMU_CH7: J4.10
FMU_CH8: J4.11
FMU_CH9: J4.34
FMU_CH10: J4.35
FMU_CH11: J4.36
FMU_CH12: J4.37
FMU_CH13: J4.23
FMU_CH14: J4.24
FMU_CH15: J4.25
FMU_CH16: J4.26
GPS1_RX: J4.52 ; port USART1.RX
GPS1_TX: J4.51 ; port USART1.TX
GPS2_RX: J4.53 ; port UART7.RX
GPS2_TX: J4.54 ; port UART7.TX
I2C_AIR_SCL: J4.15 R37.1 ; port I2C2.SCL
I2C_AIR_SDA: J4.16 R38.1 ; port I2C2.SDA
I2C_GNSS_SCL: J4.13 R35.1 ; port I2C3.SCL
I2C_GNSS_SDA: J4.14 R36.1 ; port I2C3.SDA
J1_GPIO1: J4.42
J1_GPIO2: J4.41
J1_GPIO3: J4.40
J1_GPIO4: J4.39
J1_GPIO5: J4.38
J1_GPIO6: J4.43
NARMED: J4.47 ; port NARMED
NRST: J4.71 ; port NRST
SAFETY_LED: J4.44 ; port SAFETY_LED
SAFETY_SW: J4.45 ; port SAFETY_SW
SBUS_IN: J4.17 ; port SBUS_IN
SERVO_RAIL_SENSE_F: J4.3 ; port SERVO_RAIL_SENSE_F
TELEM1_CTS: J4.58 ; port USART2.CTS
TELEM1_RTS: J4.59 ; port USART2.RTS
TELEM1_RX: J4.60 ; port USART2.RX
TELEM1_TX: J4.61 ; port USART2.TX

### Buses and harness runs
bus FMU_CH[1..16] = port FMU_CH[1..16]
bus J1_GPIO[1..6] = port J1_GPIO[1..6]

### Layout directives
differential pair: CAN1_N, CAN1_P

### Notes on the sheet
- Safety, arming, reset, boot
- UART harnesses
- Servo / ESC outputs  FMU_CH1-16
- Carrier GPIO  J1_GPIO1-6
- Analog sense (filtered)
- CAN FD 1 bus
- RC input, ESC telemetry
- PROJECT
- KEY
- POWER
- 5 V class
- 3.3 V class
- Core / SMPS
- GND
- SHEET TITLE
- SIGNALS
- NOTES
- SPI
- Analog
- Design
- I2C
- PWM/Timer
- Layout
- UART/RC
- GPIO/Ctrl
- Assembly
- CAN
- Unused pin
- Firmware
- USB/SD/Clk
- Critical
- DRAWN
- DOCUMENT NO.
- CHECKED
- REV
- STATUS
- APPROVED
- DATE
- FILE
- SIZE
- A3
- SHEET
- of

### Library data of the parts
J4 = CMP-003-000029-3: Board-To-Board Connector, DF17 Series, Surface Mount, Header, 80, 0.5 mm, Gold Plated Contacts; MF: Hirose Electric; MP: DF17(4.0)-80DP-0.5V(57); Source: DF17(4.0)-80DP-0.5V(57).SchLib; SnapEDA_Link: https://www.snapeda.com/parts/DF17(4.0)-80DP-0.5V(57)/Hirose/view-part/?ref=snap; Design Item ID: DF17(4.0)-80DP-0.5V(57); Check_prices: https://www.snapeda.com/parts/DF17(4.0)-80DP-0.5V(57)/Hirose/view-part/?ref=eda; Package: None; Component Type: Standard; Pin Count: 80; Value: *
R35-R38 = CMP-008-000000-2: as R15 on sheet Memory_EEPROM; Value: 2k2; Source: Schlib1.SchLib; Design Item ID: Generic RES 0402; Package: 0402; Tolerance: 1%; Power: 1/16W; LCSC Part #: C25879

## Sheet Interface_Conn2_Carrier_Board.SchDoc: Connector - Carrier J5 DF17 60-pin (Payload I/O)
size A3; ApprovedBy: Weymen Koo; CheckedBy: -; DrawnBy: Weymen Koo; DocumentNumber: UBCAD-FCSOM-SCH; Revision: A; SheetNumber: 18; SheetTotal: 18; ProjectTitle: Flight Controller SoM; Status: PRELIMINARY; ReleaseDate: 2026-11-14
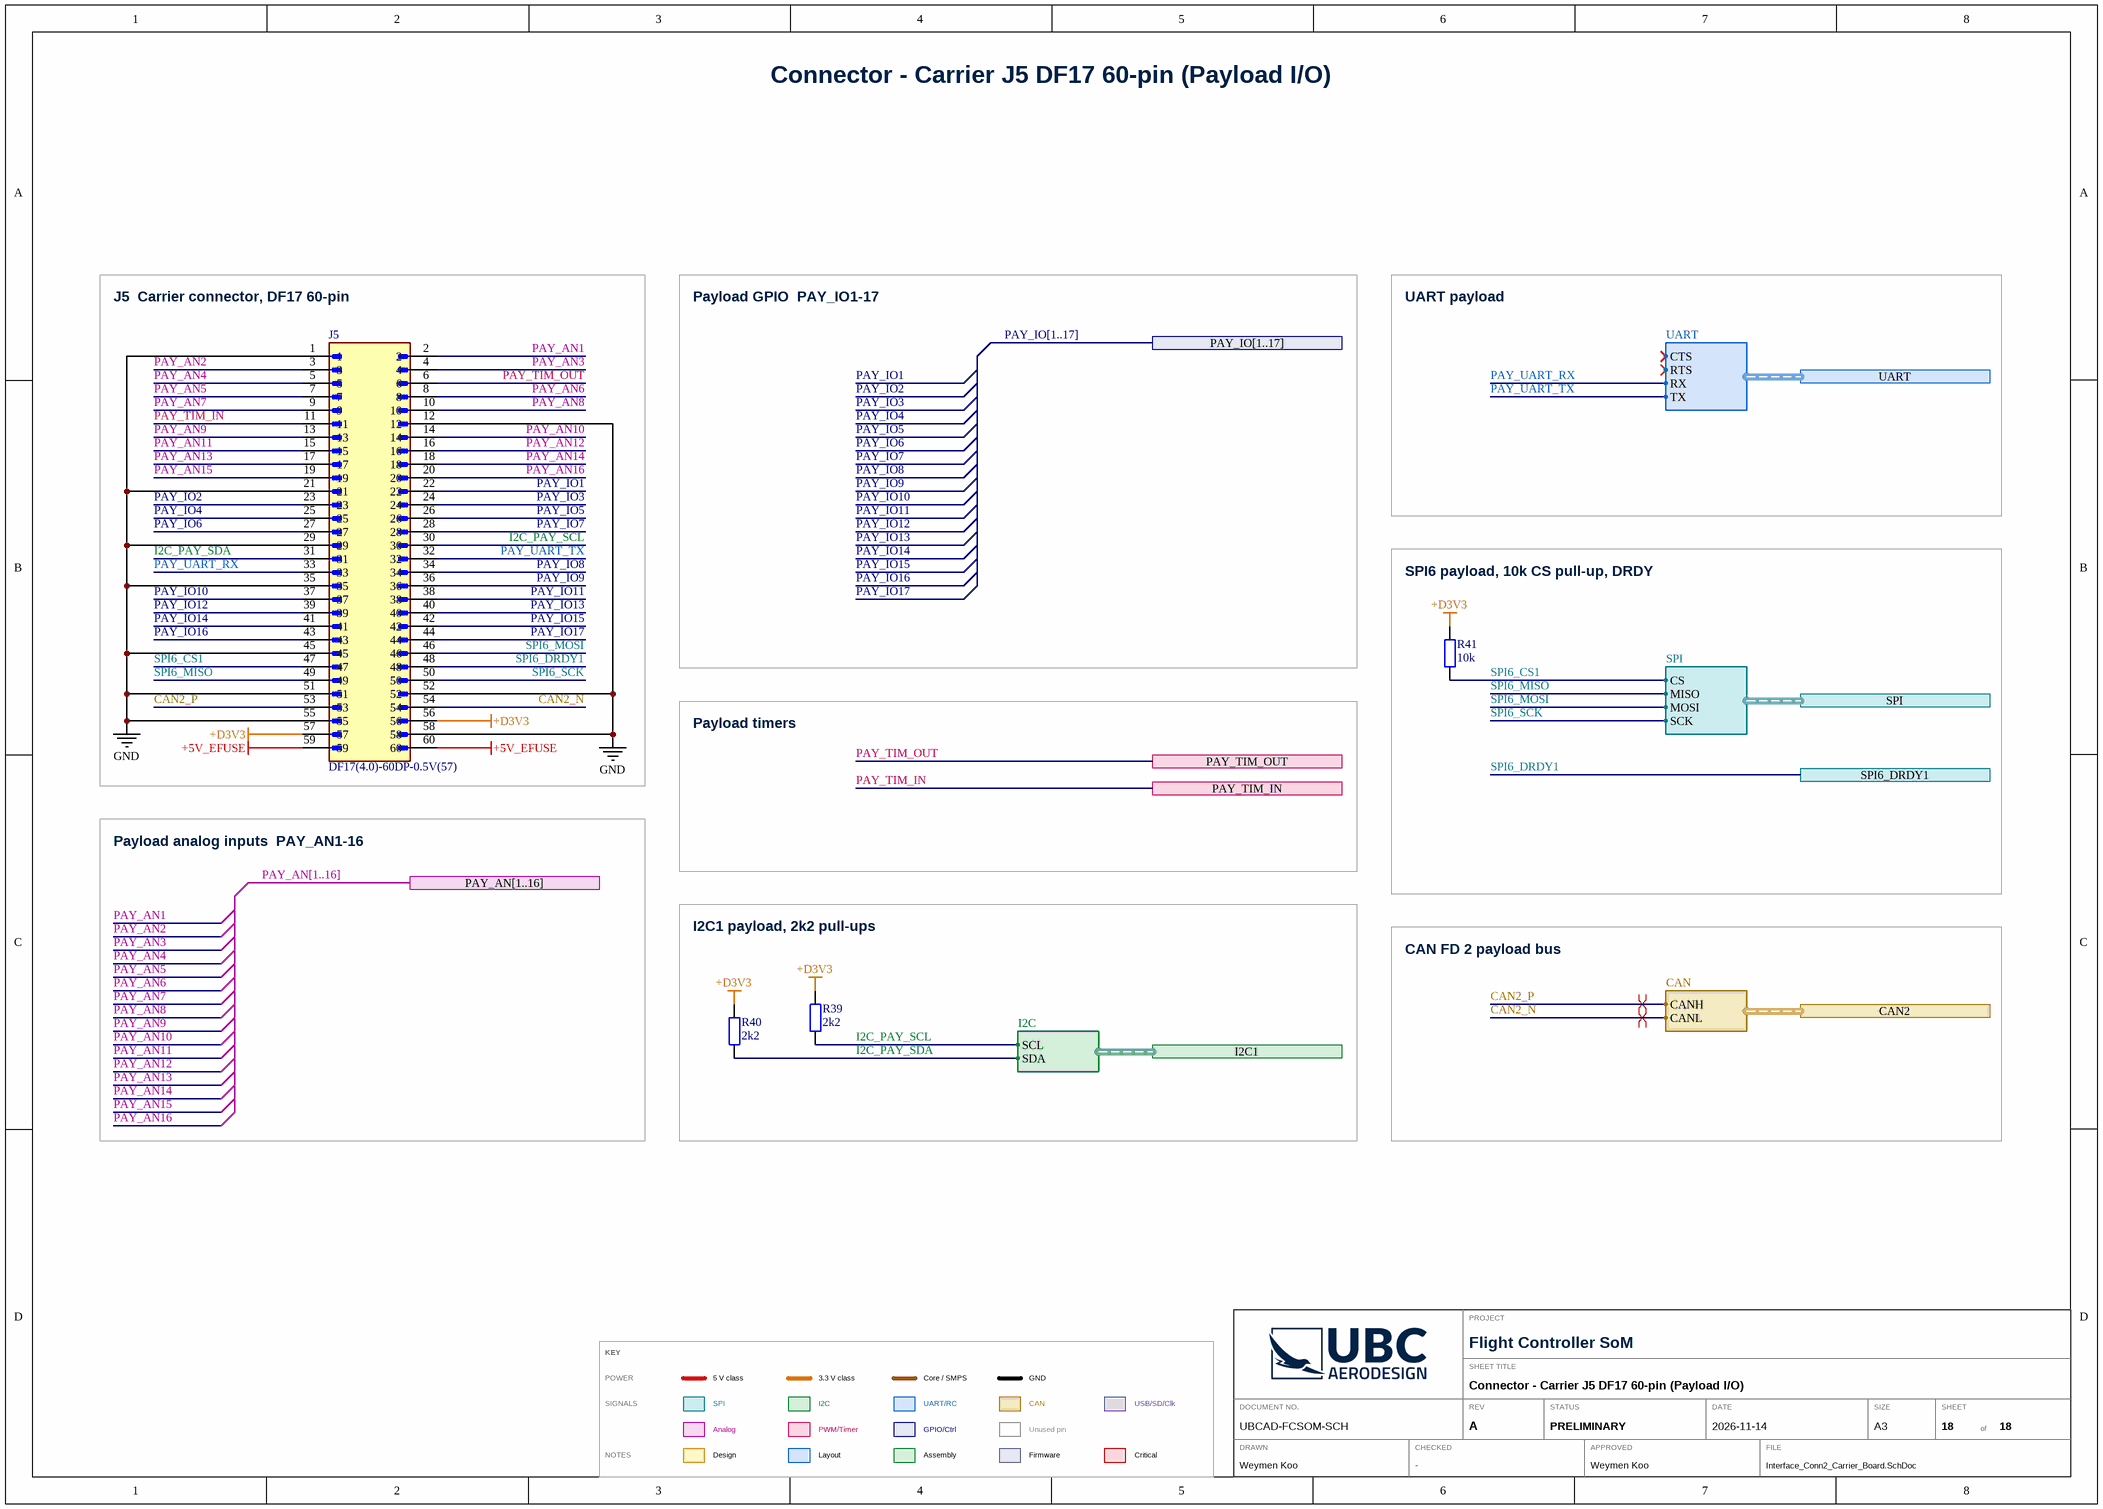
[diagram p16: Interface_Conn2_Carrier_Board.SchDoc]

### Parts
J5  DF17(4.0)-60DP-0.5V(57)  [HRS_DF17(4.0)-60DP-0.5V(57)]
R39  2k2  [IPC C R0402 NO SILK]
R40  2k2  [IPC C R0402 NO SILK]
R41  10k  [IPC C R0402 NO SILK]

### Blocks framed on the sheet
J5  Carrier connector, DF17 60-pin: J5
SPI6 payload, 10k CS pull-up, DRDY: R41
I2C1 payload, 2k2 pull-ups: R39 R40

### Ports
CAN2 (harness CAN, see 1[7A], 14[7B]), I2C1 (harness I2C, see 1[7C], 4[0@]), PAY_AN[1..16] (see 1[7C], 4[7B]), PAY_IO[1..17] (see 1[7C], 4[5B]), PAY_TIM_IN (see 1[7C], 4[9@]), PAY_TIM_OUT (see 1[7C], 4[9@]), SPI6_DRDY1 (see 1[7C], 4[7D]), SPI (harness SPI, see 1[7C], 4[8D]), UART (harness UART, see 1[7C], 4[8C])

### Harnesses
CAN: CANH, CANL
I2C: SCL, SDA
SPI: CS, MISO, MOSI, SCK
UART: CTS, RTS, RX, TX

### Nets
+5V_EFUSE: J5.59 J5.60
+D3V3: J5.56 J5.57 R39.2 R40.2 R41.2
GND: J5.1 J5.12 J5.21 J5.29 J5.35 J5.45 J5.51 J5.52 J5.55 J5.58
CAN2_N: J5.54 ; port CAN2.CANL
CAN2_P: J5.53 ; port CAN2.CANH
I2C_PAY_SCL: J5.30 R39.1 ; port I2C1.SCL
I2C_PAY_SDA: J5.31 R40.1 ; port I2C1.SDA
PAY_AN1: J5.2
PAY_AN2: J5.3
PAY_AN3: J5.4
PAY_AN4: J5.5
PAY_AN5: J5.7
PAY_AN6: J5.8
PAY_AN7: J5.9
PAY_AN8: J5.10
PAY_AN9: J5.13
PAY_AN10: J5.14
PAY_AN11: J5.15
PAY_AN12: J5.16
PAY_AN13: J5.17
PAY_AN14: J5.18
PAY_AN15: J5.19
PAY_AN16: J5.20
PAY_IO1: J5.22
PAY_IO2: J5.23
PAY_IO3: J5.24
PAY_IO4: J5.25
PAY_IO5: J5.26
PAY_IO6: J5.27
PAY_IO7: J5.28
PAY_IO8: J5.34
PAY_IO9: J5.36
PAY_IO10: J5.37
PAY_IO11: J5.38
PAY_IO12: J5.39
PAY_IO13: J5.40
PAY_IO14: J5.41
PAY_IO15: J5.42
PAY_IO16: J5.43
PAY_IO17: J5.44
PAY_TIM_IN: J5.11 ; port PAY_TIM_IN
PAY_TIM_OUT: J5.6 ; port PAY_TIM_OUT
PAY_UART_RX: J5.33 ; port UART.RX
PAY_UART_TX: J5.32 ; port UART.TX
SPI6_CS1: J5.47 R41.1 ; port SPI.CS
SPI6_DRDY1: J5.48 ; port SPI6_DRDY1
SPI6_MISO: J5.49 ; port SPI.MISO
SPI6_MOSI: J5.46 ; port SPI.MOSI
SPI6_SCK: J5.50 ; port SPI.SCK

### Buses and harness runs
bus PAY_AN[1..16] = port PAY_AN[1..16]
bus PAY_IO[1..17] = port PAY_IO[1..17]

### Layout directives
differential pair: CAN2_N, CAN2_P

### Notes on the sheet
- Payload GPIO  PAY_IO1-17
- UART payload
- Payload timers
- Payload analog inputs  PAY_AN1-16
- CAN FD 2 payload bus
- PROJECT
- KEY
- POWER
- 5 V class
- 3.3 V class
- Core / SMPS
- GND
- SHEET TITLE
- SIGNALS
- NOTES
- SPI
- Analog
- Design
- I2C
- PWM/Timer
- Layout
- UART/RC
- GPIO/Ctrl
- Assembly
- CAN
- Unused pin
- Firmware
- USB/SD/Clk
- Critical
- DRAWN
- DOCUMENT NO.
- CHECKED
- REV
- STATUS
- APPROVED
- DATE
- FILE
- SIZE
- A3
- SHEET
- of

### Library data of the parts
J5 = CMP-003-000030-2: 60 Position Connector Header, Outer Shroud Contacts Surface Mount Gold; MF: Hirose Electric; Component Type: Standard; Package: None; Pin Count: 60; Source: DF17(4.0)-60DP-0.5V(57).SchLib; Design Item ID: DF17(4.0)-60DP-0.5V(57); Check_prices: https://www.snapeda.com/parts/DF17(4.0)-60DP-0.5V(57)/Hirose/view-part/?ref=eda; SnapEDA_Link: https://www.snapeda.com/parts/DF17(4.0)-60DP-0.5V(57)/Hirose/view-part/?ref=snap; Value: *; MP: DF17(4.0)-60DP-0.5V(57)
R39 R40 = CMP-008-000000-2: RES 2k2 1% 1/16W 0402; Manufacturer: UNI-ROYAL; Manufacturer Part Number: 0402WGF2201TCE; Value: 2k2; Source: Schlib1.SchLib; Design Item ID: Generic RES 0402; Package: 0402; Tolerance: 1%; Power: 1/16W; LCSC Part #: C25879
R41 = CMP-008-000000-2: RES 10k 1% 1/16W 0402; Manufacturer: UNI-ROYAL; Manufacturer Part Number: 0402WGF1002TCE; Value: 10k; Source: Schlib1.SchLib; Design Item ID: Generic RES 0402; Package: 0402; Tolerance: 1%; Power: 1/16W; LCSC Part #: C25744

## Sheet Comms_CAN1.SchDoc: Interface - CAN FD 1 Transceiver TCAN3414
size A3; ApprovedBy: Weymen Koo; CheckedBy: -; DrawnBy: Weymen Koo; DocumentNumber: UBCAD-FCSOM-SCH; Revision: A; SheetNumber: 13; SheetTotal: 18; ProjectTitle: Flight Controller SoM; Status: PRELIMINARY; ReleaseDate: 2026-11-14
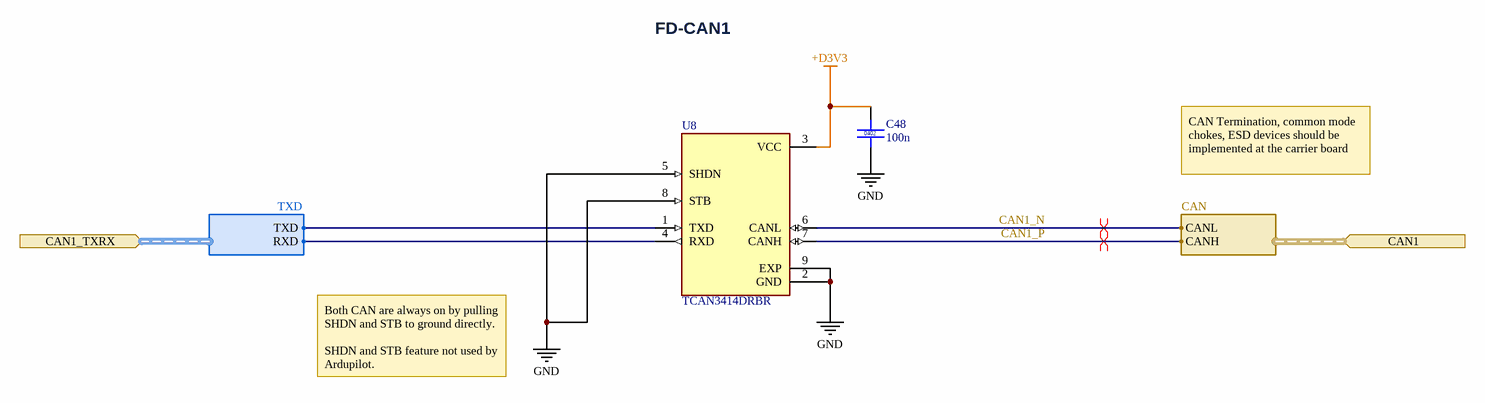
[diagram p17: Comms_CAN1.SchDoc]

### Parts
C48  100n  [CAPC1005X05N]
U8  TCAN3414DRBR  [XCVR_TCAN3414DRBR]

### Ports
CAN1 (in, harness CAN, see 1[3C], 17[7C]), CAN1_TXRX (in, harness TXD, see 1[4C], 4[5D])

### Harnesses
CAN: CANL, CANH
TXD: TXD, RXD

### Nets
+D3V3: C48.1 U8.3(VCC)
GND: C48.2 U8.2(GND) U8.5(SHDN) U8.8(STB) U8.9(EXP)
CAN1_N: U8.6(CANL) ; port CAN1.CANL
CAN1_P: U8.7(CANH) ; port CAN1.CANH
CAN1_RX: U8.4(RXD) ; port CAN1_TXRX.RXD
CAN1_TX: U8.1(TXD) ; port CAN1_TXRX.TXD

### Layout directives
differential pair: CAN1_N, CAN1_P

### Notes on the sheet
- FD-CAN1
- CAN Termination, common mode chokes, ESD devices should be implemented at the carrier board
- Both CAN are always on by pulling SHDN and STB to ground directly.
  SHDN and STB feature not used by Ardupilot.
- PROJECT
- KEY
- POWER
- 5 V class
- 3.3 V class
- Core / SMPS
- GND
- SHEET TITLE
- SIGNALS
- NOTES
- SPI
- Analog
- Design
- I2C
- PWM/Timer
- Layout
- UART/RC
- GPIO/Ctrl
- Assembly
- CAN
- Unused pin
- Firmware
- USB/SD/Clk
- Critical
- DRAWN
- DOCUMENT NO.
- CHECKED
- REV
- STATUS
- APPROVED
- DATE
- FILE
- SIZE
- A3
- SHEET
- of

### Library data of the parts
C48 = CMP-002-000094-5: CAP 100n 16V X7R 10% 0402; Manufacturer: Samsung; Manufacturer Part Number: CL05B104KO5NNNC; Value: 100n; Tolerance: 10%; Package: 0402; Voltage: 16V; Dielectric: X7R; LCSC Part #: C1525
U8 = CMP-322-000000-2: 1/1 Transceiver Half CANbus 8-SON (3x3); MF: Texas Instruments; Check_prices: https://www.snapeda.com/parts/TCAN3414DRBR/Texas+Instruments/view-part/?ref=eda; SnapEDA_Link: https://www.snapeda.com/parts/TCAN3414DRBR/Texas+Instruments/view-part/?ref=snap; MP: TCAN3414DRBR; Design Item ID: TCAN3414DRBR; Component Type: Standard; Pin Count: 9; Source: TCAN3414DRBR.SchLib; Value: *; Package: None

## Sheet Comms_CAN2.SchDoc: Interface - CAN FD 2 Transceiver TCAN3414
size A3; ApprovedBy: Weymen Koo; CheckedBy: -; DrawnBy: Weymen Koo; DocumentNumber: UBCAD-FCSOM-SCH; Revision: A; SheetNumber: 14; SheetTotal: 18; ProjectTitle: Flight Controller SoM; Status: PRELIMINARY; ReleaseDate: 2026-11-14
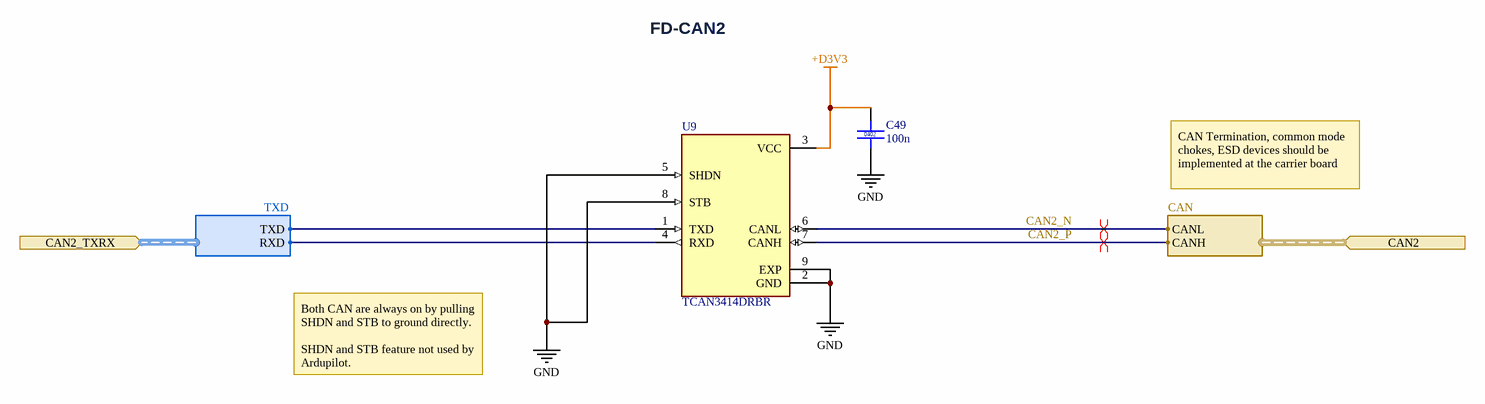
[diagram p18: Comms_CAN2.SchDoc]

### Parts
C49  100n  [CAPC1005X05N]
U9  TCAN3414DRBR  [XCVR_TCAN3414DRBR]

### Ports
CAN2 (in, harness CAN, see 1[6A], 18[7C]), CAN2_TXRX (in, harness TXD, see 1[5A], 4[5D])

### Harnesses
CAN: CANL, CANH
TXD: TXD, RXD

### Nets
+D3V3: C49.1 U9.3(VCC)
GND: C49.2 U9.2(GND) U9.5(SHDN) U9.8(STB) U9.9(EXP)
CAN2_N: U9.6(CANL) ; port CAN2.CANL
CAN2_P: U9.7(CANH) ; port CAN2.CANH
CAN2_RX: U9.4(RXD) ; port CAN2_TXRX.RXD
CAN2_TX: U9.1(TXD) ; port CAN2_TXRX.TXD

### Layout directives
differential pair: CAN2_N, CAN2_P

### Notes on the sheet
- FD-CAN2
- CAN Termination, common mode chokes, ESD devices should be implemented at the carrier board
- Both CAN are always on by pulling SHDN and STB to ground directly.
  SHDN and STB feature not used by Ardupilot.
- PROJECT
- KEY
- POWER
- 5 V class
- 3.3 V class
- Core / SMPS
- GND
- SHEET TITLE
- SIGNALS
- NOTES
- SPI
- Analog
- Design
- I2C
- PWM/Timer
- Layout
- UART/RC
- GPIO/Ctrl
- Assembly
- CAN
- Unused pin
- Firmware
- USB/SD/Clk
- Critical
- DRAWN
- DOCUMENT NO.
- CHECKED
- REV
- STATUS
- APPROVED
- DATE
- FILE
- SIZE
- A3
- SHEET
- of

### Library data of the parts
C49 = CMP-002-000094-5: as C48 on sheet Comms_CAN1; Value: 100n; Tolerance: 10%; Package: 0402; Voltage: 16V; Dielectric: X7R; LCSC Part #: C1525
U9 = CMP-322-000000-2: as U8 on sheet Comms_CAN1; Check_prices: https://www.snapeda.com/parts/TCAN3414DRBR/Texas+Instruments/view-part/?ref=eda; SnapEDA_Link: https://www.snapeda.com/parts/TCAN3414DRBR/Texas+Instruments/view-part/?ref=snap; MP: TCAN3414DRBR; Design Item ID: TCAN3414DRBR; Component Type: Standard; Pin Count: 9; Source: TCAN3414DRBR.SchLib; Value: *; Package: None

## Nets that join several sheets
+3V3LDO: Sensor_DPS368 (5 pins), Sensor_LSM6DSV32X (6 pins), Sensor_LIS2MDL (5 pins), Sensor2_MS5611 (C68.1 R33.1 U11.1), Sensor2_ICM-42688-P (6 pins), Power (C59.1 TP6.1 U12.1)
+5V_EFUSE: Power (6 pins), Interface_Conn2_Carrier_Board (J5.59 J5.60)
+D3V3: MCU_Power (60 pins), Memory_EEPROM (5 pins), Memory_FRAM (5 pins), Memory_microSD (9 pins), Button_and_LEDs (R23.2), Interface_Debug (J3.1), Power (C66.1 L2.2 R28.2), Interface_Conn1_Carrier_Board (6 pins), Interface_Conn2_Carrier_Board (5 pins), Comms_CAN1 (C48.1 U8.3), Comms_CAN2 (C49.1 U9.3)
+VCARRIER: Power (C57.1 R17.2 TP3.1 U14.5), Interface_Conn1_Carrier_Board (J4.77 J4.78 J4.79 J4.80)
GND: MCU_Power (95 pins), Memory_EEPROM (5 pins), Memory_FRAM (C46.2 U6.4), Memory_microSD (8 pins), Sensor_DPS368 (C50.2 C51.2 U3.1 U3.7), Sensor_LSM6DSV32X (7 pins), Sensor_LIS2MDL (5 pins), Sensor2_MS5611 (C68.2 U11.2 U11.3), Sensor2_ICM-42688-P (10 pins), Button_and_LEDs (D1.1 D2.1 D3.1), Interface_Debug (9 pins), MCU_IO (7 pins), Power (20 pins), Interface_Conn1_Carrier_Board (18 pins), Interface_Conn2_Carrier_Board (10 pins), Comms_CAN1 (5 pins), Comms_CAN2 (5 pins)
VBUS: Interface_Debug (J2.A4B9 J2.B4A9 R47.2 U15.5), Power (C58.1 TP2.1 U13.6), Interface_Conn1_Carrier_Board (J4.70)
BARO1_CS: Sensor_DPS368 (R21.1 U3.2), MCU_IO (U1.U7)
BARO2_CS: Sensor2_MS5611 (R33.2 U11.4 U11.5), MCU_IO (U1.T8)
BATT_I_SENSE_F: MCU_IO (R44.2), Interface_Conn1_Carrier_Board (J4.5)
BATT_V_SENSE_F: MCU_IO (R45.2), Interface_Conn1_Carrier_Board (J4.6)
BOOT0: MCU_Power (R5.2 SW1.1 U1.E8), Interface_Conn1_Carrier_Board (J4.72)
BUZZER: MCU_IO (U1.G14), Interface_Conn1_Carrier_Board (J4.46)
CAN1_N: Interface_Conn1_Carrier_Board (J4.64), Comms_CAN1 (U8.6)
CAN1_P: Interface_Conn1_Carrier_Board (J4.63), Comms_CAN1 (U8.7)
CAN1_RX: MCU_IO (U1.B17), Comms_CAN1 (U8.4)
CAN1_TX: MCU_IO (U1.D16), Comms_CAN1 (U8.1)
CAN2_N: Interface_Conn2_Carrier_Board (J5.54), Comms_CAN2 (U9.6)
CAN2_P: Interface_Conn2_Carrier_Board (J5.53), Comms_CAN2 (U9.7)
CAN2_RX: MCU_IO (U1.A5), Comms_CAN2 (U9.4)
CAN2_TX: MCU_IO (U1.B5), Comms_CAN2 (U9.1)
COMP_RX: MCU_IO (U1.F13), Interface_Conn1_Carrier_Board (J4.49)
COMP_TX: MCU_IO (U1.F14), Interface_Conn1_Carrier_Board (J4.50)
DEBUG_RX: MCU_IO (TP11.1 U1.D13), Interface_Conn1_Carrier_Board (J4.55)
DEBUG_TX: MCU_IO (TP12.1 U1.E12), Interface_Conn1_Carrier_Board (J4.56)
EEPROM_WC: Memory_EEPROM (R14.1 U7.7), MCU_IO (U1.U9)
ELRS_RX: MCU_IO (U1.T17), Interface_Conn1_Carrier_Board (J4.21)
ELRS_TX: MCU_IO (U1.U16), Interface_Conn1_Carrier_Board (J4.20)
ESC_I_SENSE_F: MCU_IO (R46.2), Interface_Conn1_Carrier_Board (J4.4)
ESC_TELEM_RX: MCU_IO (U1.T14), Interface_Conn1_Carrier_Board (J4.18)
ESC_V_SENSE_F: MCU_IO (R42.2), Interface_Conn1_Carrier_Board (J4.2)
FMU_CH1: MCU_IO (U1.R16), Interface_Conn1_Carrier_Board (J4.28)
FMU_CH2: MCU_IO (U1.R17), Interface_Conn1_Carrier_Board (J4.29)
FMU_CH3: MCU_IO (U1.P16), Interface_Conn1_Carrier_Board (J4.31)
FMU_CH4: MCU_IO (U1.P15), Interface_Conn1_Carrier_Board (J4.32)
FMU_CH5: MCU_IO (U1.P9), Interface_Conn1_Carrier_Board (J4.8)
FMU_CH6: MCU_IO (U1.P10), Interface_Conn1_Carrier_Board (J4.9)
FMU_CH7: MCU_IO (U1.T10), Interface_Conn1_Carrier_Board (J4.10)
FMU_CH8: MCU_IO (U1.U10), Interface_Conn1_Carrier_Board (J4.11)
FMU_CH9: MCU_IO (U1.N13), Interface_Conn1_Carrier_Board (J4.34)
FMU_CH10: MCU_IO (U1.N15), Interface_Conn1_Carrier_Board (J4.35)
FMU_CH11: MCU_IO (U1.J14), Interface_Conn1_Carrier_Board (J4.36)
FMU_CH12: MCU_IO (U1.B15), Interface_Conn1_Carrier_Board (J4.37)
FMU_CH13: MCU_IO (U1.P13), Interface_Conn1_Carrier_Board (J4.23)
FMU_CH14: MCU_IO (U1.P14), Interface_Conn1_Carrier_Board (J4.24)
FMU_CH15: MCU_IO (U1.R14), Interface_Conn1_Carrier_Board (J4.25)
FMU_CH16: MCU_IO (U1.A16), Interface_Conn1_Carrier_Board (J4.26)
FRAM_CS: Memory_FRAM (R13.1 U6.1), MCU_IO (U1.R15)
GPS1_RX: MCU_IO (U1.D14), Interface_Conn1_Carrier_Board (J4.52)
GPS1_TX: MCU_IO (U1.D15), Interface_Conn1_Carrier_Board (J4.51)
GPS2_RX: MCU_IO (U1.E15), Interface_Conn1_Carrier_Board (J4.53)
GPS2_TX: MCU_IO (U1.A14), Interface_Conn1_Carrier_Board (J4.54)
I2C_AIR_SCL: MCU_IO (U1.U13), Interface_Conn1_Carrier_Board (J4.15 R37.1)
I2C_AIR_SDA: MCU_IO (U1.T13), Interface_Conn1_Carrier_Board (J4.16 R38.1)
I2C_GNSS_SCL: MCU_IO (U1.P11), Interface_Conn1_Carrier_Board (J4.13 R35.1)
I2C_GNSS_SDA: MCU_IO (U1.P12), Interface_Conn1_Carrier_Board (J4.14 R36.1)
I2C_INT_SCL: Memory_EEPROM (R16.1 U7.6), Sensor_LIS2MDL (U4.1), MCU_IO (TP17.1 U1.P8)
I2C_INT_SDA: Memory_EEPROM (R15.1 U7.5), Sensor_LIS2MDL (U4.4), MCU_IO (TP16.1 U1.R9)
I2C_PAY_SCL: MCU_IO (U1.D5), Interface_Conn2_Carrier_Board (J5.30 R39.1)
I2C_PAY_SDA: MCU_IO (U1.D4), Interface_Conn2_Carrier_Board (J5.31 R40.1)
IMU1_CS: Sensor_LSM6DSV32X (R22.1 U2.12), MCU_IO (U1.U6)
IMU1_INT1: Sensor_LSM6DSV32X (U2.4), MCU_IO (TP15.1 U1.R6)
IMU2_CS: Sensor2_ICM-42688-P (R34.1 U10.12), MCU_IO (U1.U8)
IMU2_INT1: Sensor2_ICM-42688-P (U10.4), MCU_IO (TP18.1 U1.P6)
J1_GPIO1: MCU_IO (U1.J15), Interface_Conn1_Carrier_Board (J4.42)
J1_GPIO2: MCU_IO (U1.K14), Interface_Conn1_Carrier_Board (J4.41)
J1_GPIO3: MCU_IO (U1.L14), Interface_Conn1_Carrier_Board (J4.40)
J1_GPIO4: MCU_IO (U1.M14), Interface_Conn1_Carrier_Board (J4.39)
J1_GPIO5: MCU_IO (U1.N14), Interface_Conn1_Carrier_Board (J4.38)
J1_GPIO6: MCU_IO (U1.F15), Interface_Conn1_Carrier_Board (J4.43)
LED_G: Button_and_LEDs (R24.2), MCU_IO (U1.A15)
LED_R: Button_and_LEDs (R25.2), MCU_IO (U1.A10)
NARMED: MCU_IO (U1.G15), Interface_Conn1_Carrier_Board (J4.47)
NRST: MCU_Power (C36.1 SW2.1 U1.K1), Interface_Debug (J3.3), Interface_Conn1_Carrier_Board (J4.71)
PAY_AN1: MCU_IO (U1.N5), Interface_Conn2_Carrier_Board (J5.2)
PAY_AN2: MCU_IO (U1.T5), Interface_Conn2_Carrier_Board (J5.3)
PAY_AN3: MCU_IO (U1.P4), Interface_Conn2_Carrier_Board (J5.4)
PAY_AN4: MCU_IO (U1.U3), Interface_Conn2_Carrier_Board (J5.5)
PAY_AN5: MCU_IO (U1.P2), Interface_Conn2_Carrier_Board (J5.7)
PAY_AN6: MCU_IO (U1.P3), Interface_Conn2_Carrier_Board (J5.8)
PAY_AN7: MCU_IO (U1.N2), Interface_Conn2_Carrier_Board (J5.9)
PAY_AN8: MCU_IO (U1.N4), Interface_Conn2_Carrier_Board (J5.10)
PAY_AN9: MCU_IO (U1.M2), Interface_Conn2_Carrier_Board (J5.13)
PAY_AN10: MCU_IO (U1.M3), Interface_Conn2_Carrier_Board (J5.14)
PAY_AN11: MCU_IO (U1.M4), Interface_Conn2_Carrier_Board (J5.15)
PAY_AN12: MCU_IO (U1.L2), Interface_Conn2_Carrier_Board (J5.16)
PAY_AN13: MCU_IO (U1.L3), Interface_Conn2_Carrier_Board (J5.17)
PAY_AN14: MCU_IO (U1.J5), Interface_Conn2_Carrier_Board (J5.18)
PAY_AN15: MCU_IO (U1.J4), Interface_Conn2_Carrier_Board (J5.19)
PAY_AN16: MCU_IO (U1.H4), Interface_Conn2_Carrier_Board (J5.20)
PAY_IO1: MCU_IO (U1.G4), Interface_Conn2_Carrier_Board (J5.22)
PAY_IO2: MCU_IO (U1.F4), Interface_Conn2_Carrier_Board (J5.23)
PAY_IO3: MCU_IO (U1.D3), Interface_Conn2_Carrier_Board (J5.24)
PAY_IO4: MCU_IO (U1.A2), Interface_Conn2_Carrier_Board (J5.25)
PAY_IO5: MCU_IO (U1.C3), Interface_Conn2_Carrier_Board (J5.26)
PAY_IO6: MCU_IO (U1.A3), Interface_Conn2_Carrier_Board (J5.27)
PAY_IO7: MCU_IO (U1.B3), Interface_Conn2_Carrier_Board (J5.28)
PAY_IO8: MCU_IO (U1.A4), Interface_Conn2_Carrier_Board (J5.34)
PAY_IO9: MCU_IO (U1.E5), Interface_Conn2_Carrier_Board (J5.36)
PAY_IO10: MCU_IO (U1.C5), Interface_Conn2_Carrier_Board (J5.37)
PAY_IO11: MCU_IO (U1.D6), Interface_Conn2_Carrier_Board (J5.38)
PAY_IO12: MCU_IO (U1.C7), Interface_Conn2_Carrier_Board (J5.39)
PAY_IO13: MCU_IO (U1.D7), Interface_Conn2_Carrier_Board (J5.40)
PAY_IO14: MCU_IO (U1.B7), Interface_Conn2_Carrier_Board (J5.41)
PAY_IO15: MCU_IO (U1.B8), Interface_Conn2_Carrier_Board (J5.42)
PAY_IO16: MCU_IO (U1.C8), Interface_Conn2_Carrier_Board (J5.43)
PAY_IO17: MCU_IO (TP1.1 U1.A8), Interface_Conn2_Carrier_Board (J5.44)
PAY_TIM_IN: MCU_IO (U1.N3), Interface_Conn2_Carrier_Board (J5.11)
PAY_TIM_OUT: MCU_IO (U1.U2), Interface_Conn2_Carrier_Board (J5.6)
PAY_UART_RX: MCU_IO (U1.C4), Interface_Conn2_Carrier_Board (J5.33)
PAY_UART_TX: MCU_IO (U1.B4), Interface_Conn2_Carrier_Board (J5.32)
SAFETY_LED: MCU_IO (U1.H14), Interface_Conn1_Carrier_Board (J4.44)
SAFETY_SW: MCU_IO (U1.H15), Interface_Conn1_Carrier_Board (J4.45)
SBUS_IN: MCU_IO (U1.R13), Interface_Conn1_Carrier_Board (J4.17)
SD_CD: Memory_microSD (J1.10 R8.1), MCU_IO (U1.B10)
SD_CLK_R: Memory_microSD (R9.2), MCU_IO (U1.C12)
SD_CMD: Memory_microSD (J1.3 R2.1), MCU_IO (U1.D12)
SD_D0: Memory_microSD (J1.7 R7.1), MCU_IO (U1.E13)
SD_D1: Memory_microSD (J1.8 R6.1), MCU_IO (U1.E14)
SD_D2: Memory_microSD (J1.1 R4.1), MCU_IO (U1.A13)
SD_D3: Memory_microSD (J1.2 R3.1), MCU_IO (U1.B13)
SERVO_RAIL_SENSE_F: MCU_IO (R43.2), Interface_Conn1_Carrier_Board (J4.3)
SPI1_MISO: Sensor_DPS368 (U3.5), Sensor_LSM6DSV32X (U2.1), MCU_IO (TP21.1 U1.R3)
SPI1_MOSI: Sensor_DPS368 (U3.3), Sensor_LSM6DSV32X (U2.14), MCU_IO (TP20.1 U1.R5)
SPI1_SCK: Sensor_DPS368 (U3.4), Sensor_LSM6DSV32X (U2.13), MCU_IO (TP19.1 U1.T3)
SPI2_MISO: Memory_FRAM (U6.2), MCU_IO (U1.U15)
SPI2_MOSI: Memory_FRAM (U6.5), MCU_IO (U1.T15)
SPI2_SCK: Memory_FRAM (U6.6), MCU_IO (U1.U14)
SPI5_MISO: Sensor2_MS5611 (U11.6), Sensor2_ICM-42688-P (U10.1), MCU_IO (U1.K4)
SPI5_MOSI: Sensor2_MS5611 (U11.7), Sensor2_ICM-42688-P (U10.14), MCU_IO (U1.L4)
SPI5_SCK: Sensor2_MS5611 (U11.8), Sensor2_ICM-42688-P (U10.13), MCU_IO (U1.T11)
SPI6_CS1: MCU_IO (U1.A9), Interface_Conn2_Carrier_Board (J5.47 R41.1)
SPI6_DRDY1: MCU_IO (U1.B9), Interface_Conn2_Carrier_Board (J5.48)
SPI6_MISO: MCU_IO (U1.C9), Interface_Conn2_Carrier_Board (J5.49)
SPI6_MOSI: MCU_IO (U1.D8), Interface_Conn2_Carrier_Board (J5.46)
SPI6_SCK: MCU_IO (U1.D9), Interface_Conn2_Carrier_Board (J5.50)
SWCLK: Interface_Debug (J3.4), MCU_IO (U1.B14)
SWDIO: Interface_Debug (J3.2), MCU_IO (U1.C15)
SWO: Interface_Debug (J3.6), MCU_IO (U1.C6)
TELEM1_CTS: MCU_IO (U1.B12), Interface_Conn1_Carrier_Board (J4.58)
TELEM1_RTS: MCU_IO (U1.A12), Interface_Conn1_Carrier_Board (J4.59)
TELEM1_RX: MCU_IO (U1.B11), Interface_Conn1_Carrier_Board (J4.60)
TELEM1_TX: MCU_IO (U1.A11), Interface_Conn1_Carrier_Board (J4.61)
USBD_N: Interface_Debug (U15.6), MCU_IO (U1.E17)
USBD_P: Interface_Debug (U15.4), MCU_IO (U1.E16)
VBUS_SENSE: Interface_Debug (C78.1 R47.1 R48.1), MCU_IO (U1.E3)